# Altium project PCB-MAIN.PrjPcb (part 2 of 3)

## Sheet PCB-MAIN_03_AUDIO.SchDoc
size 594 x 420 mm
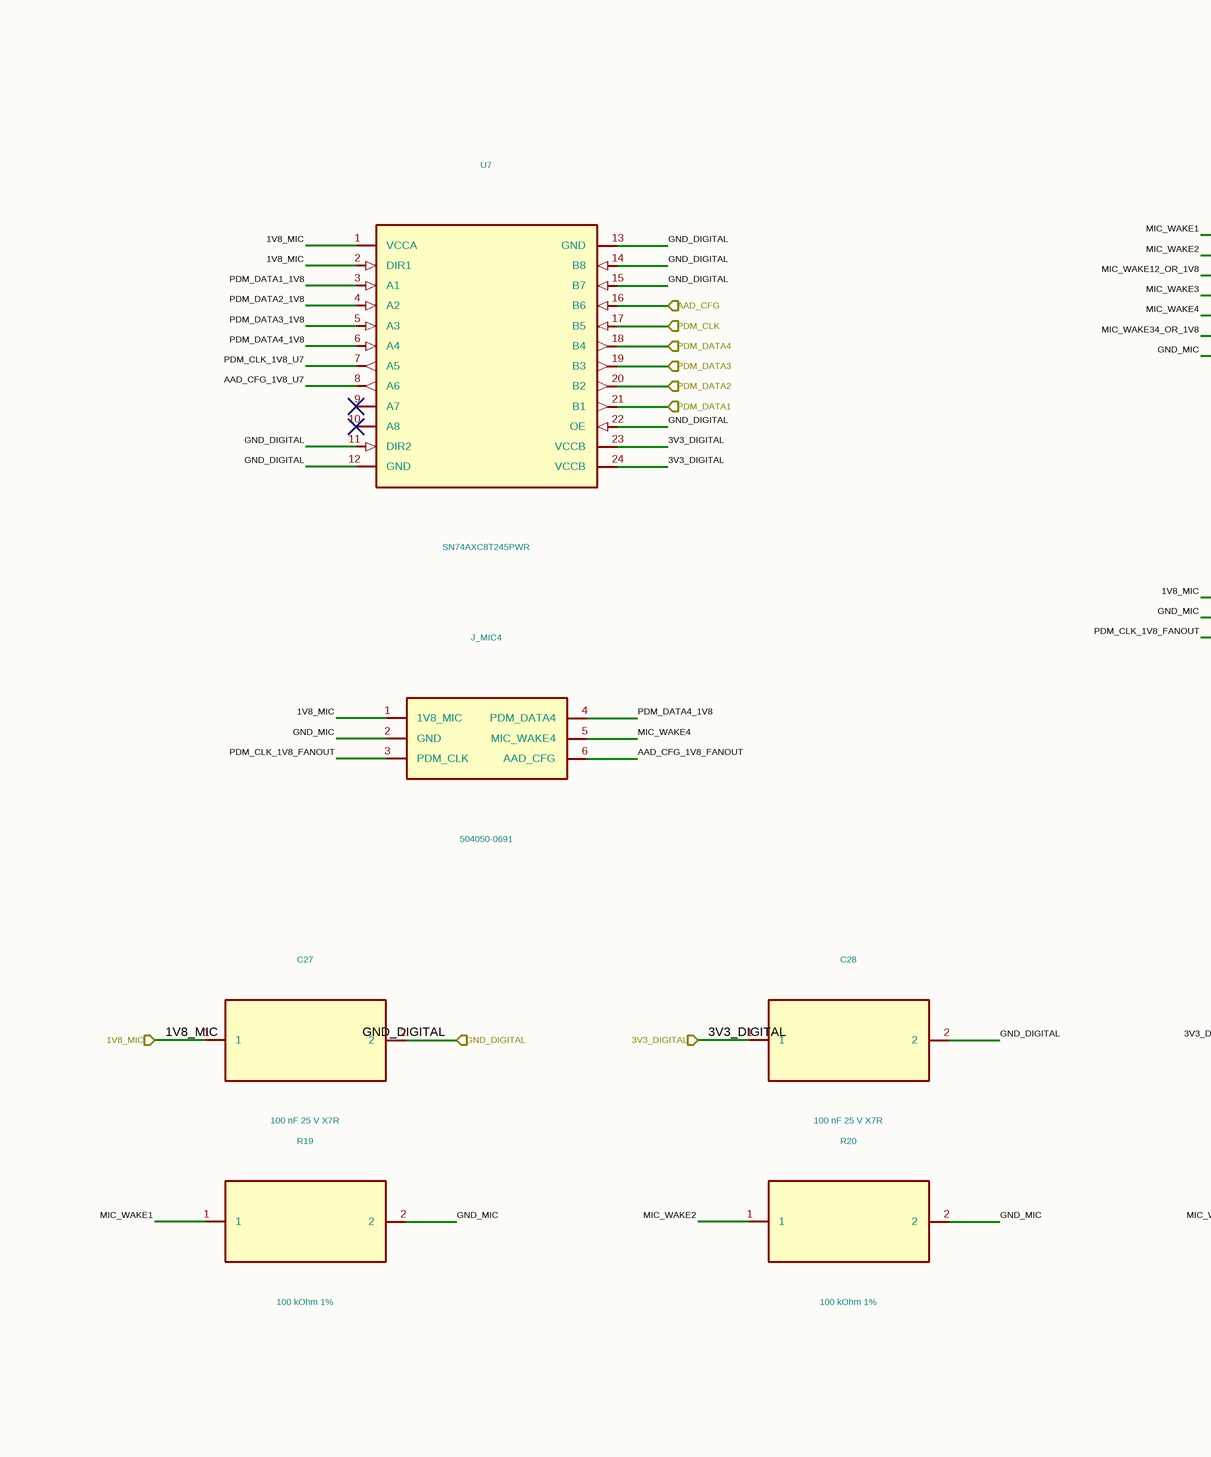
[diagram p21: PCB-MAIN_03_AUDIO.SchDoc, top left]
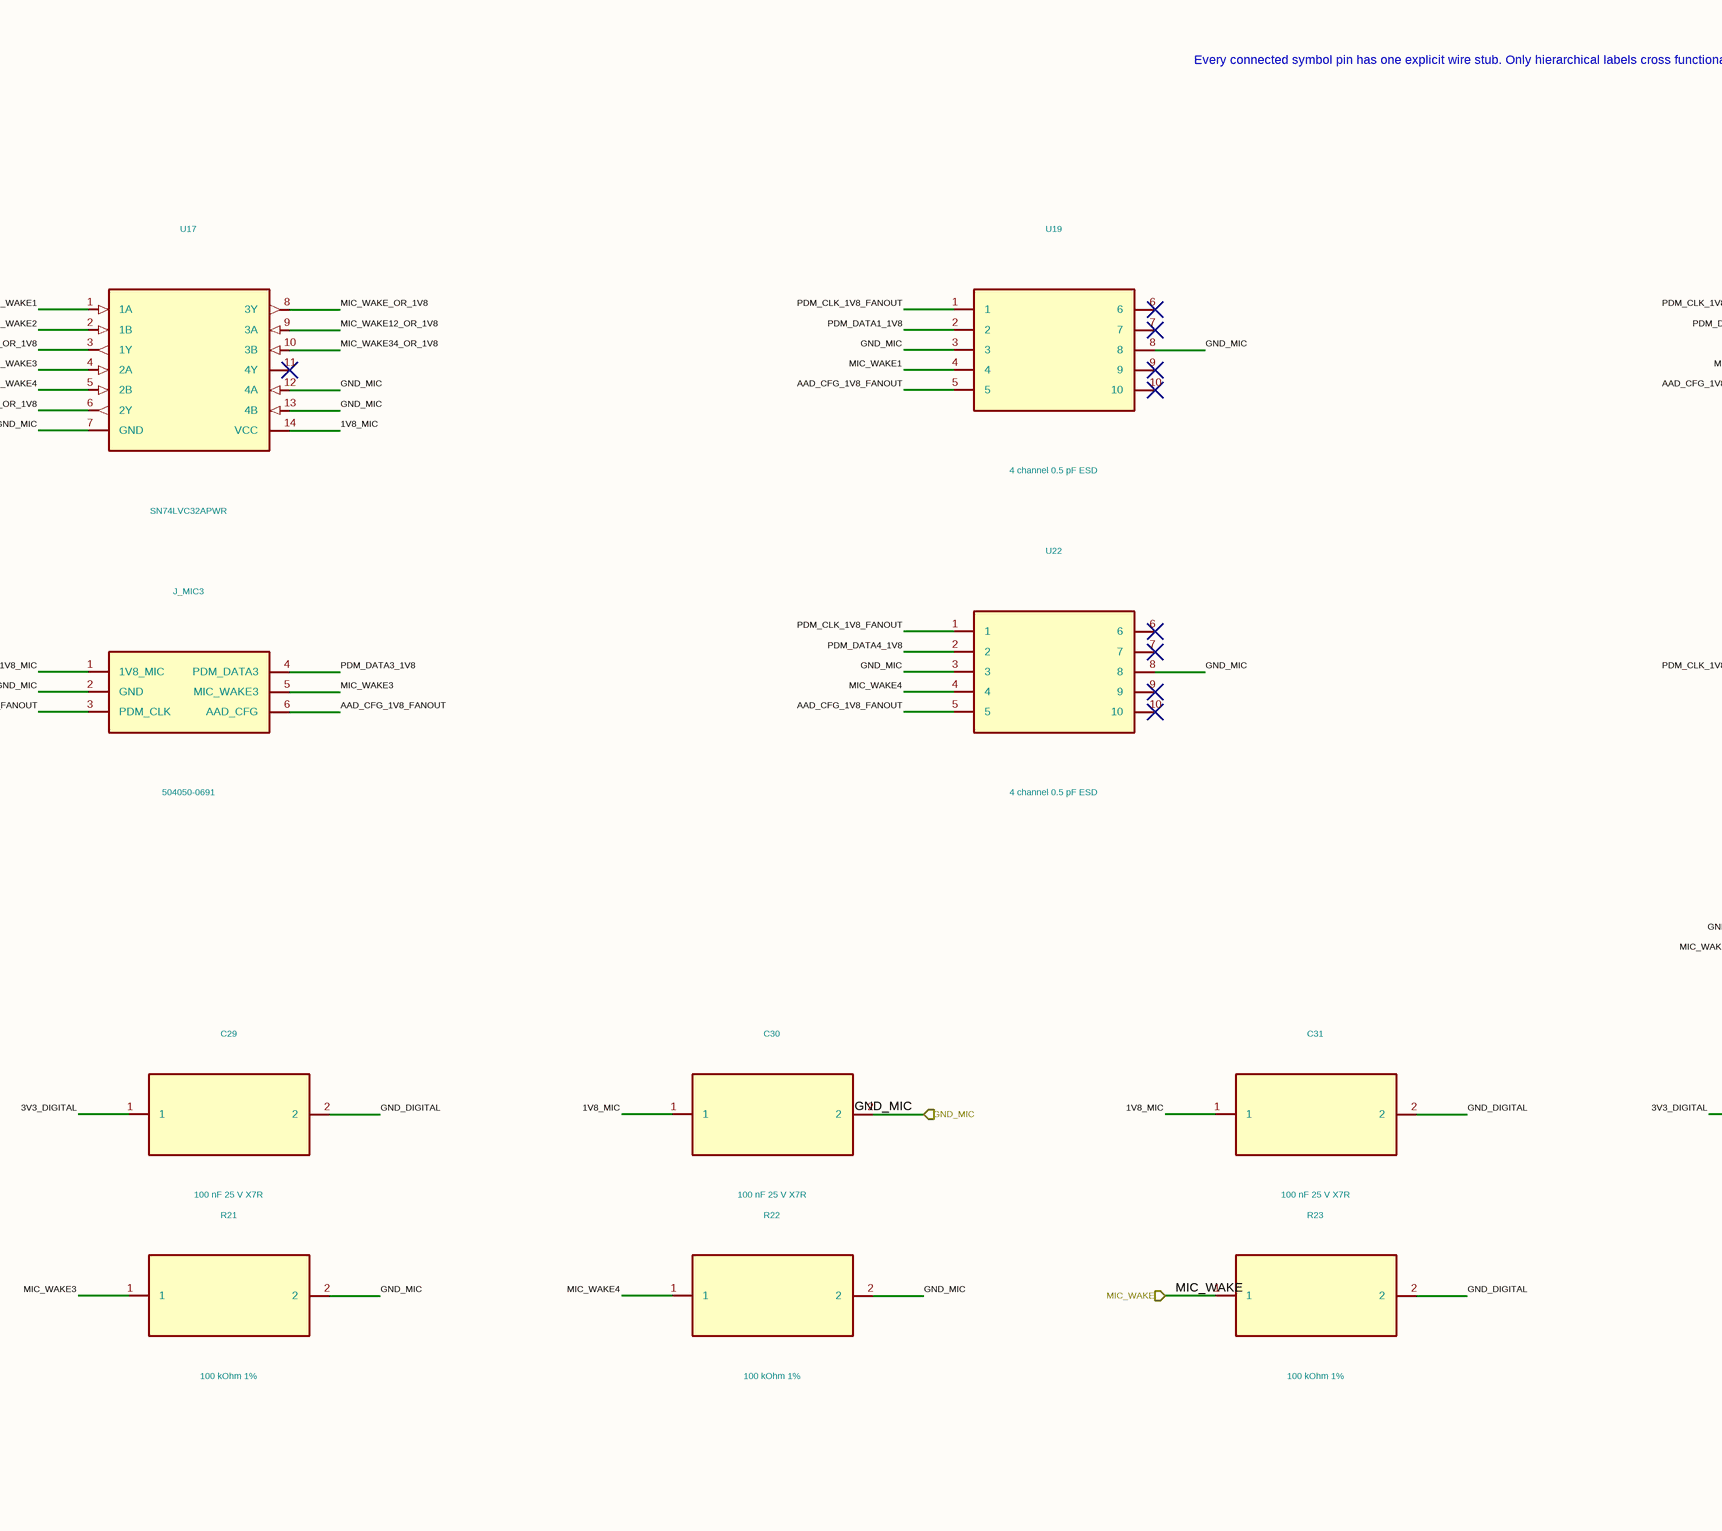
[diagram p22: PCB-MAIN_03_AUDIO.SchDoc, top middle]
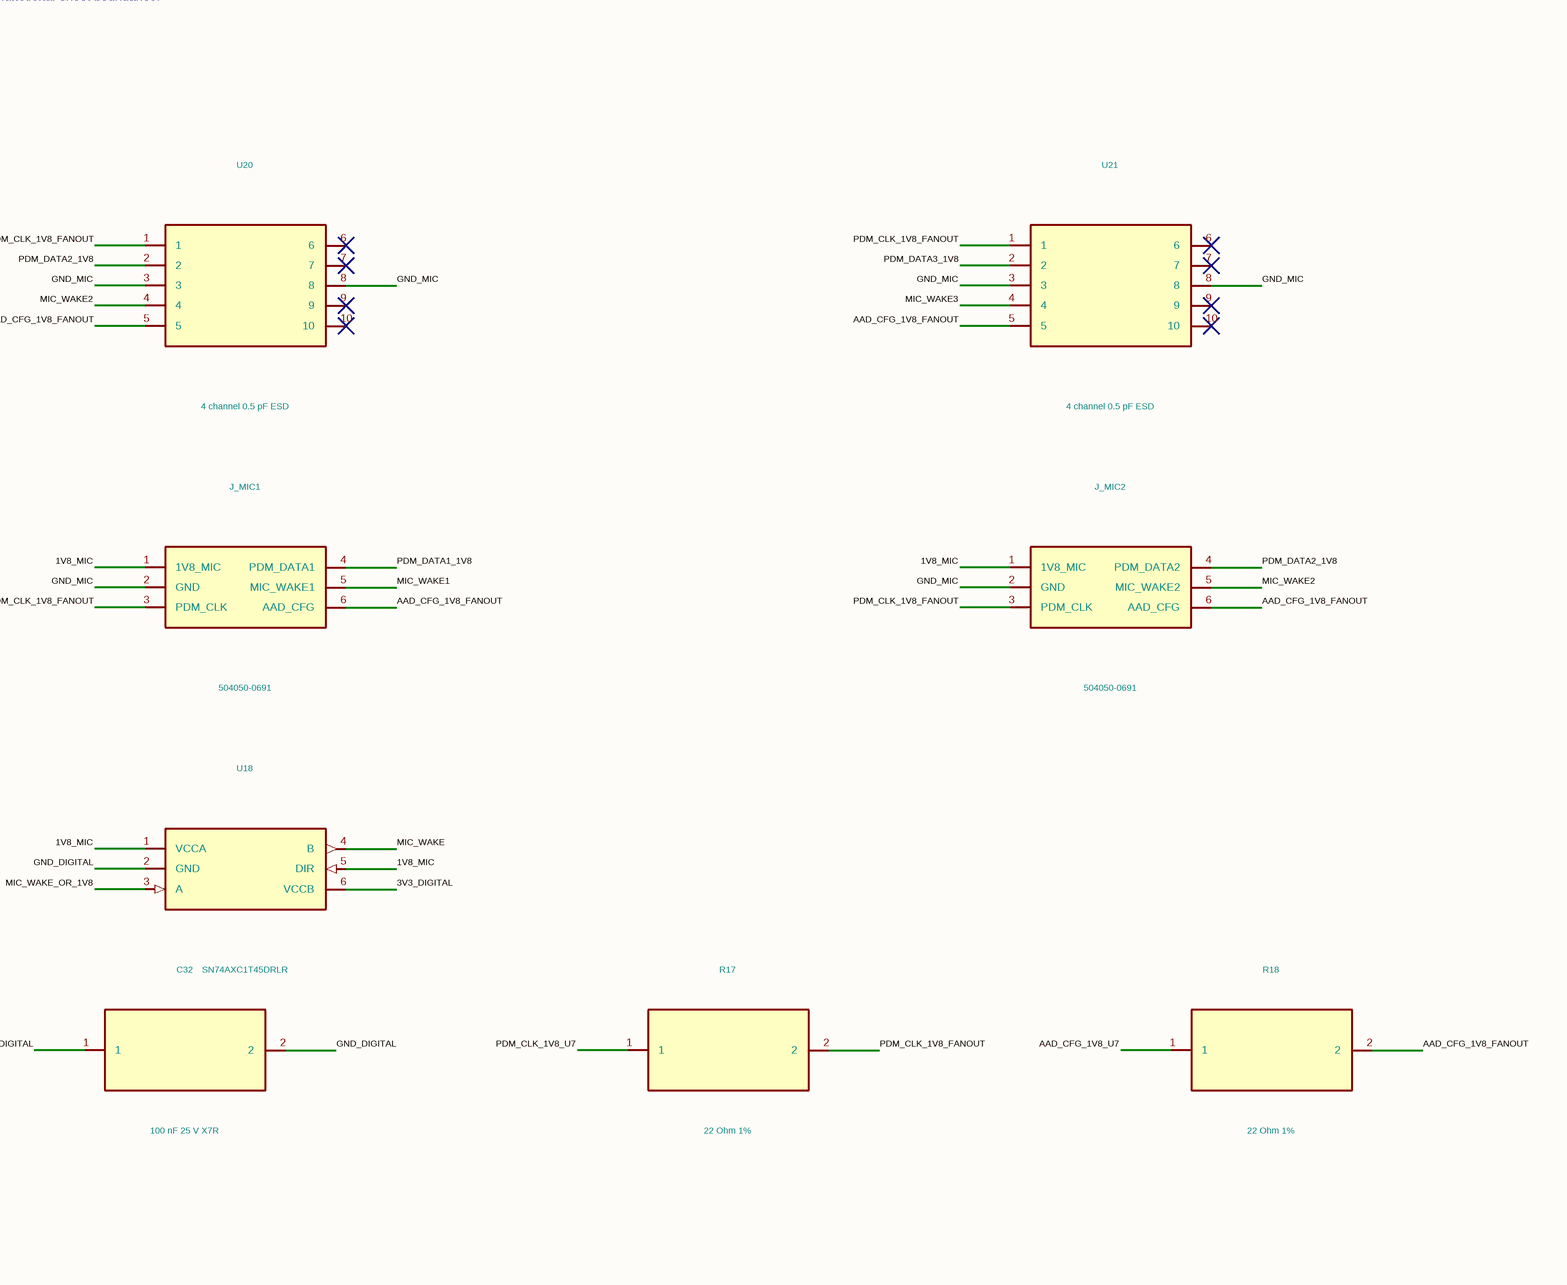
[diagram p23: PCB-MAIN_03_AUDIO.SchDoc, top right]
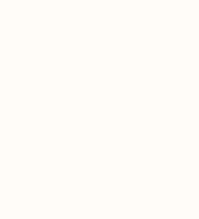
[diagram p24: PCB-MAIN_03_AUDIO.SchDoc, bottom left]

### Parts
C27  100 nF 25 V X7R  [C_0402_1005Metric]
C28  100 nF 25 V X7R  [C_0402_1005Metric]
C29  100 nF 25 V X7R  [C_0402_1005Metric]
C30  100 nF 25 V X7R  [C_0402_1005Metric]
C31  100 nF 25 V X7R  [C_0402_1005Metric]
C32  100 nF 25 V X7R  [C_0402_1005Metric]
J_MIC1  504050-0691
J_MIC2  504050-0691
J_MIC3  504050-0691
J_MIC4  504050-0691
R17  22 Ohm 1%  [R_0402_1005Metric]
R18  22 Ohm 1%  [R_0402_1005Metric]
R19  100 kOhm 1%  [R_0402_1005Metric]
R20  100 kOhm 1%  [R_0402_1005Metric]
R21  100 kOhm 1%  [R_0402_1005Metric]
R22  100 kOhm 1%  [R_0402_1005Metric]
R23  100 kOhm 1%  [R_0402_1005Metric]
U7  SN74AXC8T245PWR
U17  SN74LVC32APWR
U18  SN74AXC1T45DRLR
U19  4 channel 0.5 pF ESD
U20  4 channel 0.5 pF ESD
U21  4 channel 0.5 pF ESD
U22  4 channel 0.5 pF ESD

### Ports
1V8_MIC, 3V3_DIGITAL, AAD_CFG, GND_DIGITAL, GND_MIC, MIC_WAKE, PDM_CLK, PDM_DATA1, PDM_DATA2, PDM_DATA3, PDM_DATA4

### Nets
1V8_MIC: C27.1 C30.1 C31.1 J_MIC1.1(1V8_MIC) J_MIC2.1(1V8_MIC) J_MIC3.1(1V8_MIC) J_MIC4.1(1V8_MIC) U7.1(VCCA) U7.2(DIR1) U17.14(VCC) U18.1(VCCA) U18.5(DIR) ; port 1V8_MIC
3V3_DIGITAL: C28.1 C29.1 C32.1 U7.23(VCCB) U7.24(VCCB) U18.6(VCCB) ; port 3V3_DIGITAL
AAD_CFG: U7.16(B6) ; port AAD_CFG
AAD_CFG_1V8_FANOUT: J_MIC1.6(AAD_CFG) J_MIC2.6(AAD_CFG) J_MIC3.6(AAD_CFG) J_MIC4.6(AAD_CFG) R18.2 U19.5 U20.5 U21.5 U22.5
AAD_CFG_1V8_U7: R18.1 U7.8(A6)
GND_DIGITAL: C27.2 C28.2 C29.2 C31.2 C32.2 R23.2 U7.11(DIR2) U7.12(GND) U7.13(GND) U7.14(B8) U7.15(B7) U7.22(OE) U18.2(GND) ; port GND_DIGITAL
GND_MIC: C30.2 J_MIC1.2(GND) J_MIC2.2(GND) J_MIC3.2(GND) J_MIC4.2(GND) R19.2 R20.2 R21.2 R22.2 U17.7(GND) U17.12(4A) U17.13(4B) U19.3 U19.8 U20.3 U20.8 U21.3 U21.8 U22.3 U22.8 ; port GND_MIC
MIC_WAKE: R23.1 U18.4(B) ; port MIC_WAKE
MIC_WAKE1: J_MIC1.5(MIC_WAKE1) R19.1 U17.1(1A) U19.4
MIC_WAKE2: J_MIC2.5(MIC_WAKE2) R20.1 U17.2(1B) U20.4
MIC_WAKE3: J_MIC3.5(MIC_WAKE3) R21.1 U17.4(2A) U21.4
MIC_WAKE4: J_MIC4.5(MIC_WAKE4) R22.1 U17.5(2B) U22.4
MIC_WAKE12_OR_1V8: U17.3(1Y) U17.9(3A)
MIC_WAKE34_OR_1V8: U17.6(2Y) U17.10(3B)
MIC_WAKE_OR_1V8: U17.8(3Y) U18.3(A)
PDM_CLK: U7.17(B5) ; port PDM_CLK
PDM_CLK_1V8_FANOUT: J_MIC1.3(PDM_CLK) J_MIC2.3(PDM_CLK) J_MIC3.3(PDM_CLK) J_MIC4.3(PDM_CLK) R17.2 U19.1 U20.1 U21.1 U22.1
PDM_CLK_1V8_U7: R17.1 U7.7(A5)
PDM_DATA1: U7.21(B1) ; port PDM_DATA1
PDM_DATA1_1V8: J_MIC1.4(PDM_DATA1) U7.3(A1) U19.2
PDM_DATA2: U7.20(B2) ; port PDM_DATA2
PDM_DATA2_1V8: J_MIC2.4(PDM_DATA2) U7.4(A2) U20.2
PDM_DATA3: U7.19(B3) ; port PDM_DATA3
PDM_DATA3_1V8: J_MIC3.4(PDM_DATA3) U7.5(A3) U21.2
PDM_DATA4: U7.18(B4) ; port PDM_DATA4
PDM_DATA4_1V8: J_MIC4.4(PDM_DATA4) U7.6(A4) U22.2

Not connected (* = marked no-connect by the designer): U7 9(A7)* 10(A8)*; U17 11(4Y)*; U19 6* 7* 9* 10*; U20 6* 7* 9* 10*; U21 6* 7* 9* 10*; U22 6* 7* 9* 10*

### Notes on the sheet
- Every connected symbol pin has one explicit wire stub. Only hierarchical labels cross functional-sheet boundaries.
- 1
- 2
- 3
- 4
- 5
- 6
- 7
- 8
- 9
- 10
- 11
- A
- B
- C
- D
- E
- F
- G
- H
- Human-readable hierarchy candidate; exact Review-A pin/net equivalence enforced
- Functional sheet 4 of 10
- NOT FOR MANUFACTURE - hierarchy review/routing/DRC/DFM/Review B pending
- Title: Dioneya PCB-MAIN Rev.A - PDM audio
- File: PCB-MAIN_03_AUDIO.kicad_sch
- Sheet: /
- Dioneya / ZS-BPLA
- KiCad E.D.A.  kicad (5.1.4)-1
- Size: A2
- Date: 2026-09-16
- Rev: A
- Id: 1/1

### Library data of the parts
C27 = C27_GRM155R71E104KE14D: Manufacturer: Murata; Population: FITTED; Authority: TI_SCES875C_RevC; MPN: GRM155R71E104KE14D; Package: 0402; Value: 100 nF 25 V X7R; Footprint: Capacitor_SMD:C_0402_1005Metric
C28 = C28_GRM155R71E104KE14D: Manufacturer: Murata; Population: FITTED; Authority: TI_SCES875C_RevC; MPN: GRM155R71E104KE14D; Package: 0402; Value: 100 nF 25 V X7R; Footprint: Capacitor_SMD:C_0402_1005Metric
C29 = C29_GRM155R71E104KE14D: Manufacturer: Murata; Population: FITTED; Authority: TI_SCES875C_RevC; MPN: GRM155R71E104KE14D; Package: 0402; Value: 100 nF 25 V X7R; Footprint: Capacitor_SMD:C_0402_1005Metric
C30 = C30_GRM155R71E104KE14D: Manufacturer: Murata; Population: FITTED; Authority: TI_SCAS286U_RevU; MPN: GRM155R71E104KE14D; Package: 0402; Value: 100 nF 25 V X7R; Footprint: Capacitor_SMD:C_0402_1005Metric
C31 = C31_GRM155R71E104KE14D: Manufacturer: Murata; Population: FITTED; Authority: TI_SCES882E_RevE; MPN: GRM155R71E104KE14D; Package: 0402; Value: 100 nF 25 V X7R; Footprint: Capacitor_SMD:C_0402_1005Metric
C32 = C32_GRM155R71E104KE14D: Manufacturer: Murata; Population: FITTED; Authority: TI_SCES882E_RevE; MPN: GRM155R71E104KE14D; Package: 0402; Value: 100 nF 25 V X7R; Footprint: Capacitor_SMD:C_0402_1005Metric
J_MIC1 = J_MIC1_504050-0691: Manufacturer: Molex; Population: FITTED; Authority: HARNESS_LOGICAL_PINOUT_REV_A.csv; MPN: 504050-0691; Package: Pico-Lock_1.5_1x06_Right_Angle; Value: 504050-0691
J_MIC2 = J_MIC2_504050-0691: Manufacturer: Molex; Population: FITTED; Authority: HARNESS_LOGICAL_PINOUT_REV_A.csv; MPN: 504050-0691; Package: Pico-Lock_1.5_1x06_Right_Angle; Value: 504050-0691
J_MIC3 = J_MIC3_504050-0691: Manufacturer: Molex; Population: FITTED; Authority: HARNESS_LOGICAL_PINOUT_REV_A.csv; MPN: 504050-0691; Package: Pico-Lock_1.5_1x06_Right_Angle; Value: 504050-0691
J_MIC4 = J_MIC4_504050-0691: Manufacturer: Molex; Population: FITTED; Authority: HARNESS_LOGICAL_PINOUT_REV_A.csv; MPN: 504050-0691; Package: Pico-Lock_1.5_1x06_Right_Angle; Value: 504050-0691
R17 = R17_ERJ-2RKF22R0X: Manufacturer: Panasonic; Population: FITTED; Authority: PROJECT_MAIN_AUTH_010; MPN: ERJ-2RKF22R0X; Package: 0402; Value: 22 Ohm 1%; Footprint: Resistor_SMD:R_0402_1005Metric
R18 = R18_ERJ-2RKF22R0X: Manufacturer: Panasonic; Population: FITTED; Authority: PROJECT_MAIN_AUTH_010; MPN: ERJ-2RKF22R0X; Package: 0402; Value: 22 Ohm 1%; Footprint: Resistor_SMD:R_0402_1005Metric
R19 = R19_ERJ-2RKF1003X: Manufacturer: Panasonic; Population: FITTED; Authority: TDK_T5838_DS-000383_Rev1.2; MPN: ERJ-2RKF1003X; Package: 0402; Value: 100 kOhm 1%; Footprint: Resistor_SMD:R_0402_1005Metric
R20 = R20_ERJ-2RKF1003X: Manufacturer: Panasonic; Population: FITTED; Authority: TDK_T5838_DS-000383_Rev1.2; MPN: ERJ-2RKF1003X; Package: 0402; Value: 100 kOhm 1%; Footprint: Resistor_SMD:R_0402_1005Metric
R21 = R21_ERJ-2RKF1003X: Manufacturer: Panasonic; Population: FITTED; Authority: TDK_T5838_DS-000383_Rev1.2; MPN: ERJ-2RKF1003X; Package: 0402; Value: 100 kOhm 1%; Footprint: Resistor_SMD:R_0402_1005Metric
R22 = R22_ERJ-2RKF1003X: Manufacturer: Panasonic; Population: FITTED; Authority: TDK_T5838_DS-000383_Rev1.2; MPN: ERJ-2RKF1003X; Package: 0402; Value: 100 kOhm 1%; Footprint: Resistor_SMD:R_0402_1005Metric
R23 = R23_ERJ-2RKF1003X: Manufacturer: Panasonic; Population: FITTED; Authority: TI_SCES882E_RevE; MPN: ERJ-2RKF1003X; Package: 0402; Value: 100 kOhm 1%; Footprint: Resistor_SMD:R_0402_1005Metric
U7 = U7_SN74AXC8T245PWR: Manufacturer: Texas Instruments; Population: FITTED; Authority: PCB_MAIN_AUDIO_LOGIC_PIN_AUTHORITY_REV_A.csv; MPN: SN74AXC8T245PWR; Package: TSSOP-24_PW; Value: SN74AXC8T245PWR
U17 = U17_SN74LVC32APWR: Manufacturer: Texas Instruments; Population: FITTED; Authority: PCB_MAIN_AUDIO_LOGIC_PIN_AUTHORITY_REV_A.csv; MPN: SN74LVC32APWR; Package: TSSOP-14_PW; Value: SN74LVC32APWR
U18 = U18_SN74AXC1T45DRLR: Manufacturer: Texas Instruments; Population: FITTED; Authority: PCB_MAIN_AUDIO_LOGIC_PIN_AUTHORITY_REV_A.csv; MPN: SN74AXC1T45DRLR; Package: SOT-5X3-6_DRL; Value: SN74AXC1T45DRLR
U19 = U19_TPD4E05U06DQAR: Manufacturer: Texas Instruments; Population: FITTED; Authority: TI_TPDxE05U06_RevO; MPN: TPD4E05U06DQAR; Package: USON-10_DQA; Value: 4 channel 0.5 pF ESD
U20 = U20_TPD4E05U06DQAR: Manufacturer: Texas Instruments; Population: FITTED; Authority: TI_TPDxE05U06_RevO; MPN: TPD4E05U06DQAR; Package: USON-10_DQA; Value: 4 channel 0.5 pF ESD
U21 = U21_TPD4E05U06DQAR: Manufacturer: Texas Instruments; Population: FITTED; Authority: TI_TPDxE05U06_RevO; MPN: TPD4E05U06DQAR; Package: USON-10_DQA; Value: 4 channel 0.5 pF ESD
U22 = U22_TPD4E05U06DQAR: Manufacturer: Texas Instruments; Population: FITTED; Authority: TI_TPDxE05U06_RevO; MPN: TPD4E05U06DQAR; Package: USON-10_DQA; Value: 4 channel 0.5 pF ESD

## Sheet PCB-MAIN_04_GNSS.SchDoc
size 594 x 420 mm
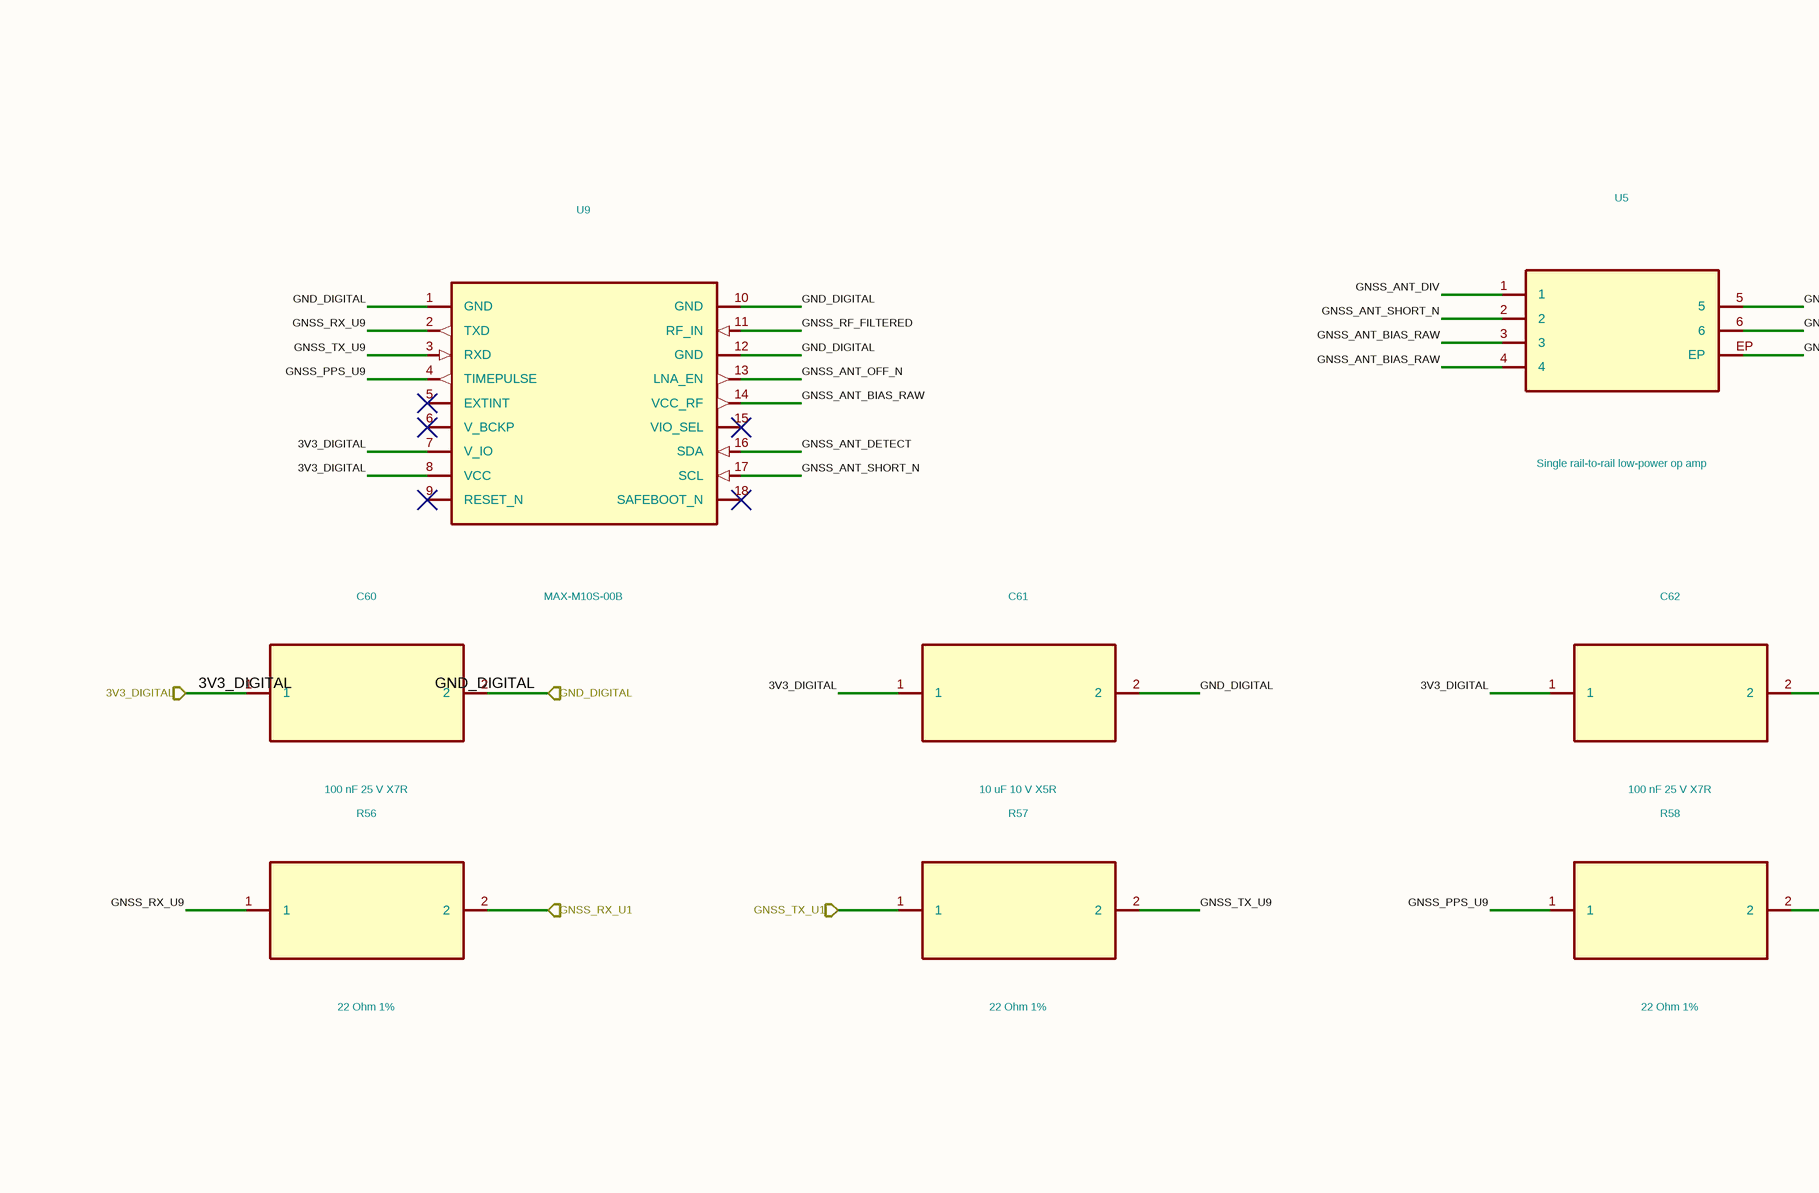
[diagram p25: PCB-MAIN_04_GNSS.SchDoc, top left]
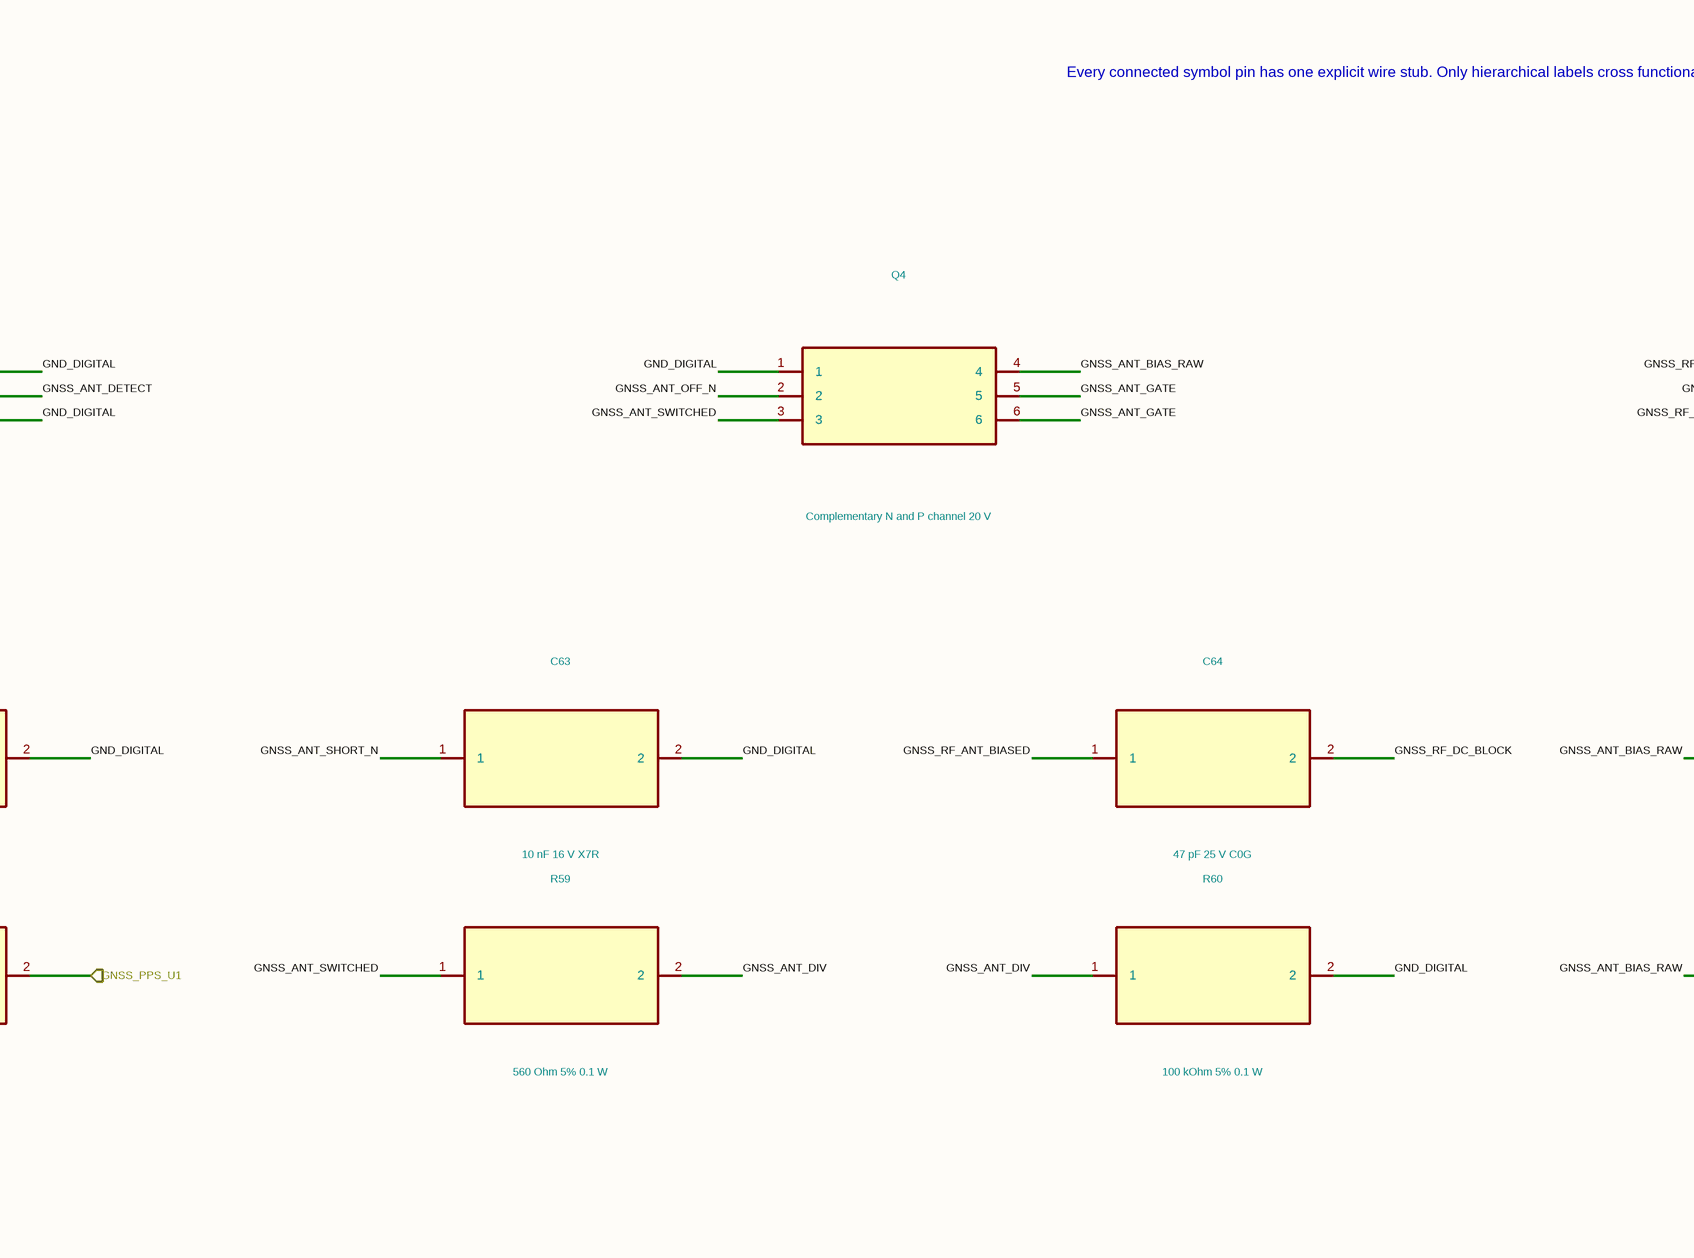
[diagram p26: PCB-MAIN_04_GNSS.SchDoc, top middle]
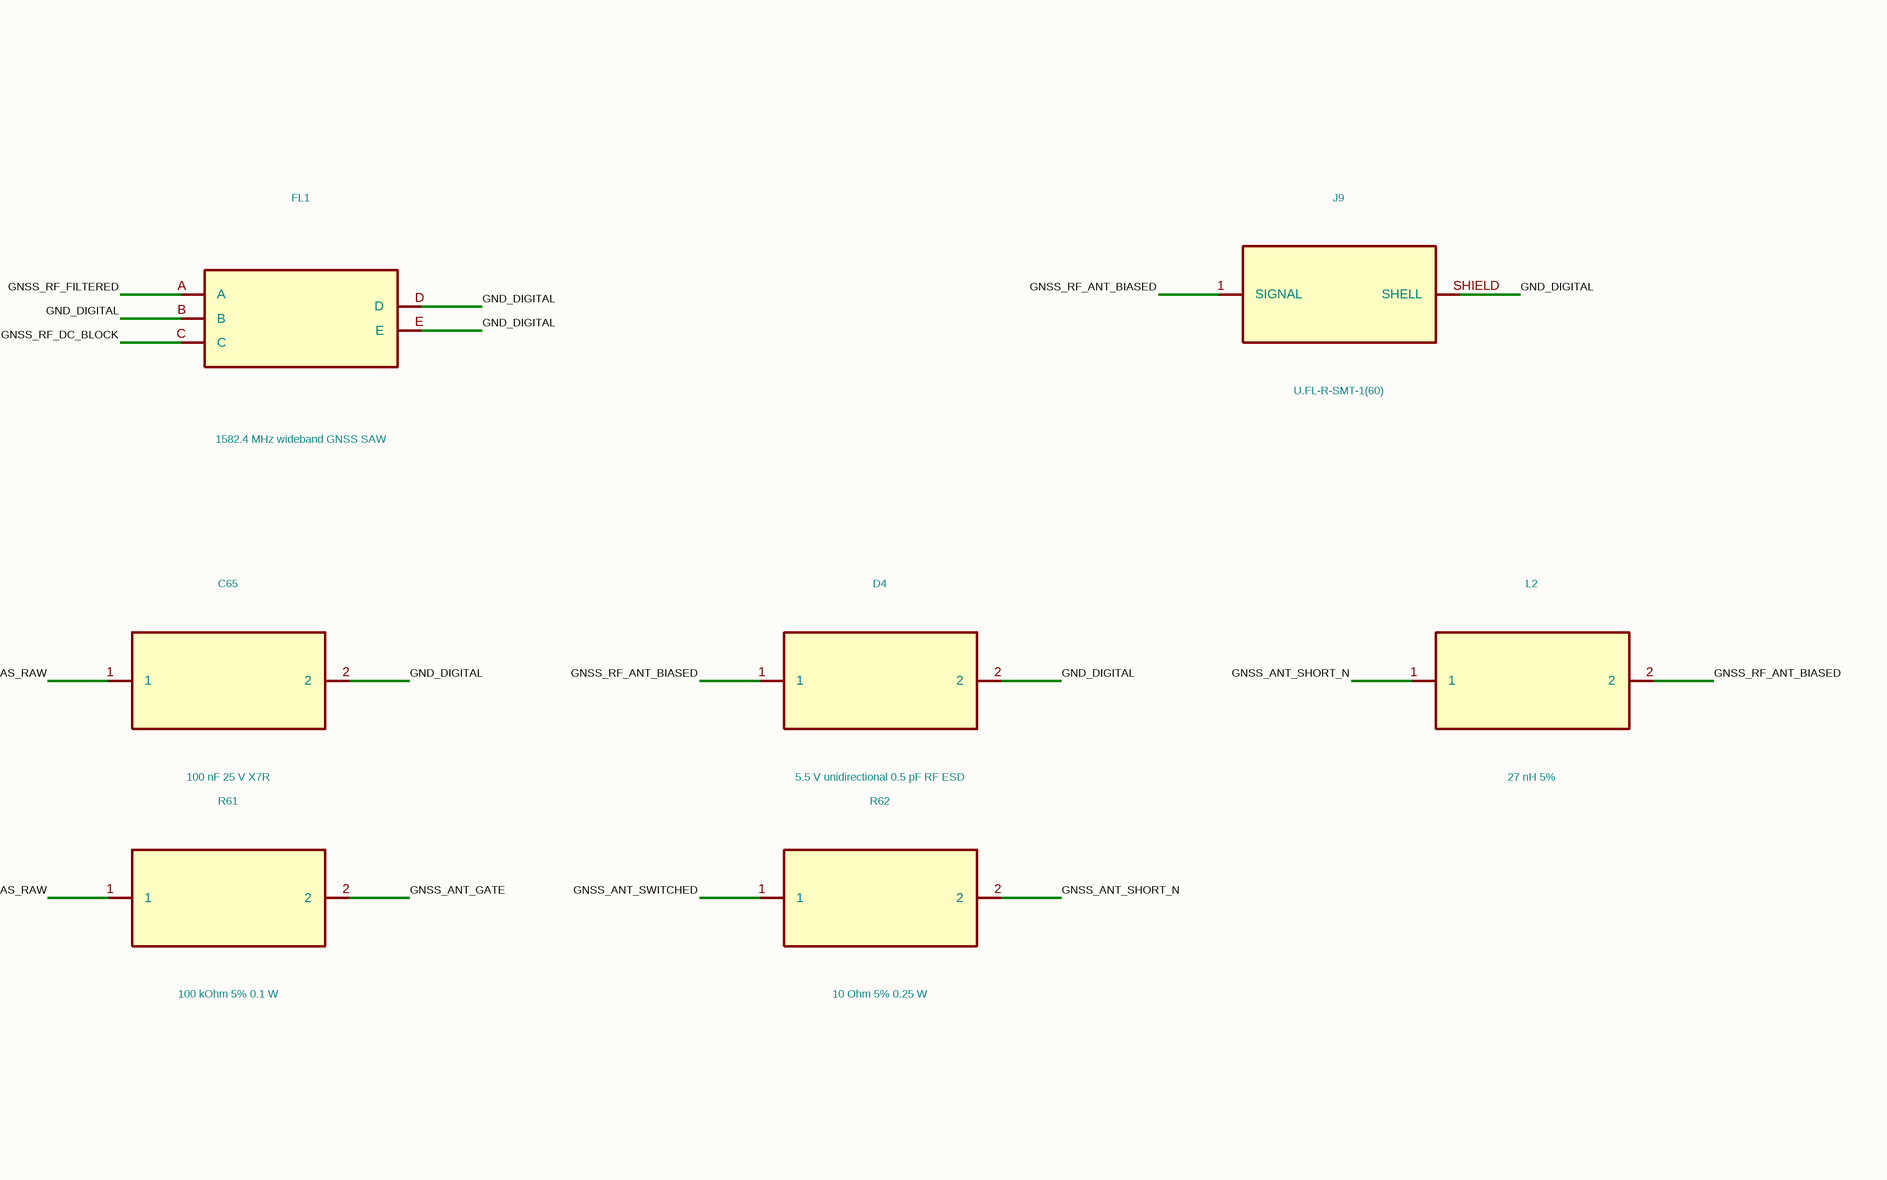
[diagram p27: PCB-MAIN_04_GNSS.SchDoc, top right]
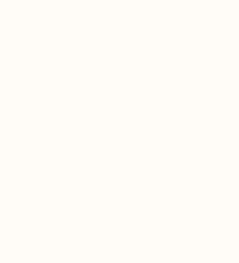
[diagram p28: PCB-MAIN_04_GNSS.SchDoc, bottom left]

### Parts
C60  100 nF 25 V X7R  [C_0402_1005Metric]
C61  10 uF 10 V X5R  [C_0603_1608Metric]
C62  100 nF 25 V X7R  [C_0402_1005Metric]
C63  10 nF 16 V X7R  [C_0402_1005Metric]
C64  47 pF 25 V C0G  [C_0402_1005Metric]
C65  100 nF 25 V X7R  [C_0402_1005Metric]
D4  5.5 V unidirectional 0.5 pF RF ESD
FL1  1582.4 MHz wideband GNSS SAW
J9  U.FL-R-SMT-1(60)
L2  27 nH 5%  [L_0402_1005Metric]
Q4  Complementary N and P channel 20 V
R56  22 Ohm 1%  [R_0402_1005Metric]
R57  22 Ohm 1%  [R_0402_1005Metric]
R58  22 Ohm 1%  [R_0402_1005Metric]
R59  560 Ohm 5% 0.1 W  [R_0402_1005Metric]
R60  100 kOhm 5% 0.1 W  [R_0402_1005Metric]
R61  100 kOhm 5% 0.1 W  [R_0402_1005Metric]
R62  10 Ohm 5% 0.25 W  [R_1206_3216Metric]
U5  Single rail-to-rail low-power op amp
U9  MAX-M10S-00B

### Ports
3V3_DIGITAL, GND_DIGITAL, GNSS_PPS_U1, GNSS_RX_U1, GNSS_TX_U1

### Nets
3V3_DIGITAL: C60.1 C61.1 C62.1 U9.7(V_IO) U9.8(VCC) ; port 3V3_DIGITAL
GND_DIGITAL: C60.2 C61.2 C62.2 C63.2 C65.2 D4.2 FL1.B FL1.D FL1.E J9.SHIELD(SHELL) Q4.1 R60.2 U5.5 U5.EP U9.1(GND) U9.10(GND) U9.12(GND) ; port GND_DIGITAL
GNSS_ANT_BIAS_RAW: C65.1 Q4.4 R61.1 U5.3 U5.4 U9.14(VCC_RF)
GNSS_ANT_DETECT: U5.6 U9.16(SDA)
GNSS_ANT_DIV: R59.2 R60.1 U5.1
GNSS_ANT_GATE: Q4.5 Q4.6 R61.2
GNSS_ANT_OFF_N: Q4.2 U9.13(LNA_EN)
GNSS_ANT_SHORT_N: C63.1 L2.1 R62.2 U5.2 U9.17(SCL)
GNSS_ANT_SWITCHED: Q4.3 R59.1 R62.1
GNSS_PPS_U1: R58.2 ; port GNSS_PPS_U1
GNSS_PPS_U9: R58.1 U9.4(TIMEPULSE)
GNSS_RF_ANT_BIASED: C64.1 D4.1 J9.1(SIGNAL) L2.2
GNSS_RF_DC_BLOCK: C64.2 FL1.C
GNSS_RF_FILTERED: FL1.A U9.11(RF_IN)
GNSS_RX_U1: R56.2 ; port GNSS_RX_U1
GNSS_RX_U9: R56.1 U9.2(TXD)
GNSS_TX_U1: R57.1 ; port GNSS_TX_U1
GNSS_TX_U9: R57.2 U9.3(RXD)

Not connected (* = marked no-connect by the designer): U9 5(EXTINT)* 6(V_BCKP)* 9(RESET_N)* 15(VIO_SEL)* 18(SAFEBOOT_N)*

### Notes on the sheet
- Every connected symbol pin has one explicit wire stub. Only hierarchical labels cross functional-sheet boundaries.
- 1
- 2
- 3
- 4
- 5
- 6
- 7
- 8
- 9
- 10
- 11
- A
- B
- C
- D
- E
- F
- G
- H
- Human-readable hierarchy candidate; exact Review-A pin/net equivalence enforced
- Functional sheet 5 of 10
- NOT FOR MANUFACTURE - hierarchy review/routing/DRC/DFM/Review B pending
- Title: Dioneya PCB-MAIN Rev.A - GNSS
- File: PCB-MAIN_04_GNSS.kicad_sch
- Sheet: /
- Dioneya / ZS-BPLA
- KiCad E.D.A.  kicad (5.1.4)-1
- Size: A2
- Date: 2026-09-16
- Rev: A
- Id: 1/1

### Library data of the parts
C60 = C60_GRM155R71E104KE14D: Manufacturer: Murata; Population: FITTED; Authority: u-blox_UBX-20053088_R05; MPN: GRM155R71E104KE14D; Package: 0402; Value: 100 nF 25 V X7R; Footprint: Capacitor_SMD:C_0402_1005Metric
C61 = C61_GRM188R61A106KE69D: Manufacturer: Murata; Population: FITTED; Authority: u-blox_UBX-20053088_R05; MPN: GRM188R61A106KE69D; Package: 0603; Value: 10 uF 10 V X5R; Footprint: Capacitor_SMD:C_0603_1608Metric
C62 = C62_GRM155R71E104KE14D: Manufacturer: Murata; Population: FITTED; Authority: u-blox_UBX-20053088_R05; MPN: GRM155R71E104KE14D; Package: 0402; Value: 100 nF 25 V X7R; Footprint: Capacitor_SMD:C_0402_1005Metric
C63 = C63_GRM155R71C103KA01D: Manufacturer: Murata; Population: FITTED; Authority: u-blox_UBX-20053088_R05; MPN: GRM155R71C103KA01D; Package: 0402; Value: 10 nF 16 V X7R; Footprint: Capacitor_SMD:C_0402_1005Metric
C64 = C64_GRM1555C1E470JA01D: Manufacturer: Murata; Population: FITTED; Authority: u-blox_UBX-20053088_R05; MPN: GRM1555C1E470JA01D; Package: 0402; Value: 47 pF 25 V C0G; Footprint: Capacitor_SMD:C_0402_1005Metric
C65 = C65_GRM155R71E104KE14D: Manufacturer: Murata; Population: FITTED; Authority: ADI_LT6000_datasheet; MPN: GRM155R71E104KE14D; Package: 0402; Value: 100 nF 25 V X7R; Footprint: Capacitor_SMD:C_0402_1005Metric
D4 = D4_TPD1E05U06DYAR: Manufacturer: Texas Instruments; Population: FITTED; Authority: TI_TPDxE05U06_RevO; MPN: TPD1E05U06DYAR; Package: SOD-523_DYA; Value: 5.5 V unidirectional 0.5 pF RF ESD
FL1 = FL1_ABSES5AF-L100KM: Manufacturer: Abracon; Population: FITTED; Authority: Abracon_ABSES5AF-L100KM_2025-09-16; MPN: ABSES5AF-L100KM; Package: 1109-5; Value: 1582.4 MHz wideband GNSS SAW
J9 = J9_U.FL-R-SMT-1_60: Manufacturer: CONTROLLED_AUTHORITY; Population: FITTED; Authority: PCB_MAIN_GNSS_PIN_AUTHORITY_REV_A.csv;PCB_MAIN_CONNECTOR_FIXTURE_PIN_AUTHORITY_REV_A.csv; MPN: U.FL-R-SMT-1(60); Package: U.FL_SMT; Value: U.FL-R-SMT-1(60)
L2 = L2_LQW15AN27NJ00D: Manufacturer: Murata; Population: FITTED; Authority: u-blox_UBX-20053088_R05; MPN: LQW15AN27NJ00D; Package: 0402; Value: 27 nH 5%; Footprint: Inductor_SMD:L_0402_1005Metric
Q4 = Q4_Si1016X-T1-GE3: Manufacturer: Vishay; Population: FITTED; Authority: Vishay_Si1016X_RevE; MPN: Si1016X-T1-GE3; Package: SOT-563_SC-89; Value: Complementary N and P channel 20 V
R56 = R56_ERJ-2RKF22R0X: Manufacturer: Panasonic; Population: FITTED; Authority: u-blox_UBX-20053088_R05; MPN: ERJ-2RKF22R0X; Package: 0402; Value: 22 Ohm 1%; Footprint: Resistor_SMD:R_0402_1005Metric
R57 = R57_ERJ-2RKF22R0X: Manufacturer: Panasonic; Population: FITTED; Authority: u-blox_UBX-20053088_R05; MPN: ERJ-2RKF22R0X; Package: 0402; Value: 22 Ohm 1%; Footprint: Resistor_SMD:R_0402_1005Metric
R58 = R58_ERJ-2RKF22R0X: Manufacturer: Panasonic; Population: FITTED; Authority: u-blox_UBX-20053088_R05; MPN: ERJ-2RKF22R0X; Package: 0402; Value: 22 Ohm 1%; Footprint: Resistor_SMD:R_0402_1005Metric
R59 = R59_ERJ-2GEJ561X: Manufacturer: Panasonic; Population: FITTED; Authority: u-blox_UBX-20053088_R05; MPN: ERJ-2GEJ561X; Package: 0402; Value: 560 Ohm 5% 0.1 W; Footprint: Resistor_SMD:R_0402_1005Metric
R60 = R60_ERJ-2GEJ104X: Manufacturer: Panasonic; Population: FITTED; Authority: u-blox_UBX-20053088_R05; MPN: ERJ-2GEJ104X; Package: 0402; Value: 100 kOhm 5% 0.1 W; Footprint: Resistor_SMD:R_0402_1005Metric
R61 = R61_ERJ-2GEJ104X: Manufacturer: Panasonic; Population: FITTED; Authority: u-blox_UBX-20053088_R05; MPN: ERJ-2GEJ104X; Package: 0402; Value: 100 kOhm 5% 0.1 W; Footprint: Resistor_SMD:R_0402_1005Metric
R62 = R62_ERJ-8GEYJ100V: Manufacturer: Panasonic; Population: FITTED; Authority: u-blox_UBX-20053088_R05; MPN: ERJ-8GEYJ100V; Package: 1206; Value: 10 Ohm 5% 0.25 W; Footprint: Resistor_SMD:R_1206_3216Metric
U5 = U5_LT6000IDCB_TRMPBF: Manufacturer: Analog Devices; MPN: LT6000IDCB#TRMPBF; Population: FITTED; Authority: ADI_LT6000_datasheet; Package: DFN-6_DCB_2x3mm; Value: Single rail-to-rail low-power op amp
U9 = U9_MAX-M10S-00B: Manufacturer: u-blox; Population: FITTED; Authority: PCB_MAIN_GNSS_PIN_AUTHORITY_REV_A.csv; MPN: MAX-M10S-00B; Package: LCC-18_9.7x10.1mm; Value: MAX-M10S-00B

## Sheet PCB-MAIN_05_CELLULAR.SchDoc
size 594 x 420 mm
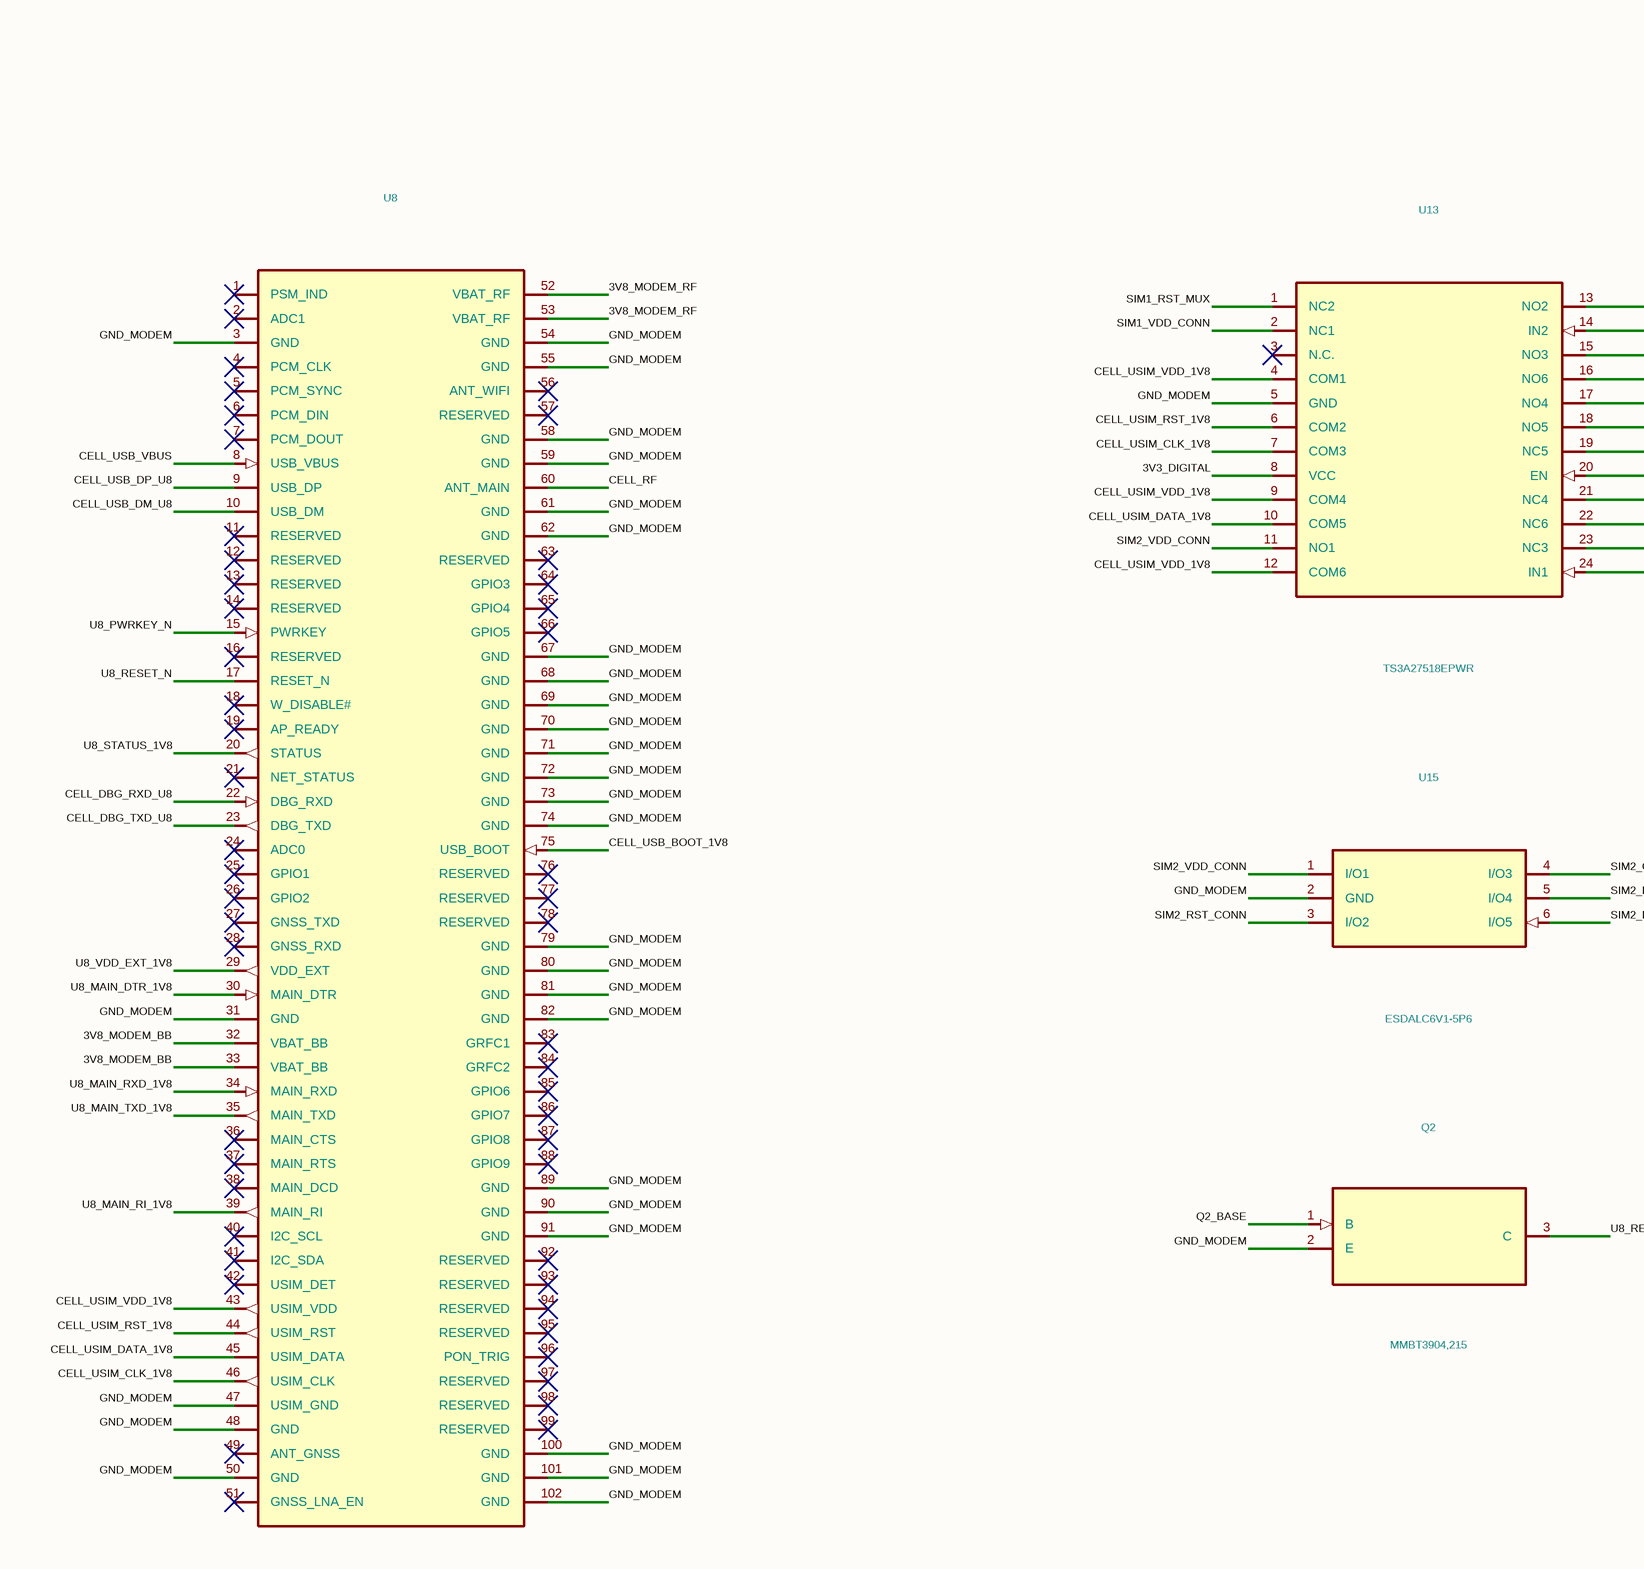
[diagram p29: PCB-MAIN_05_CELLULAR.SchDoc, top left]
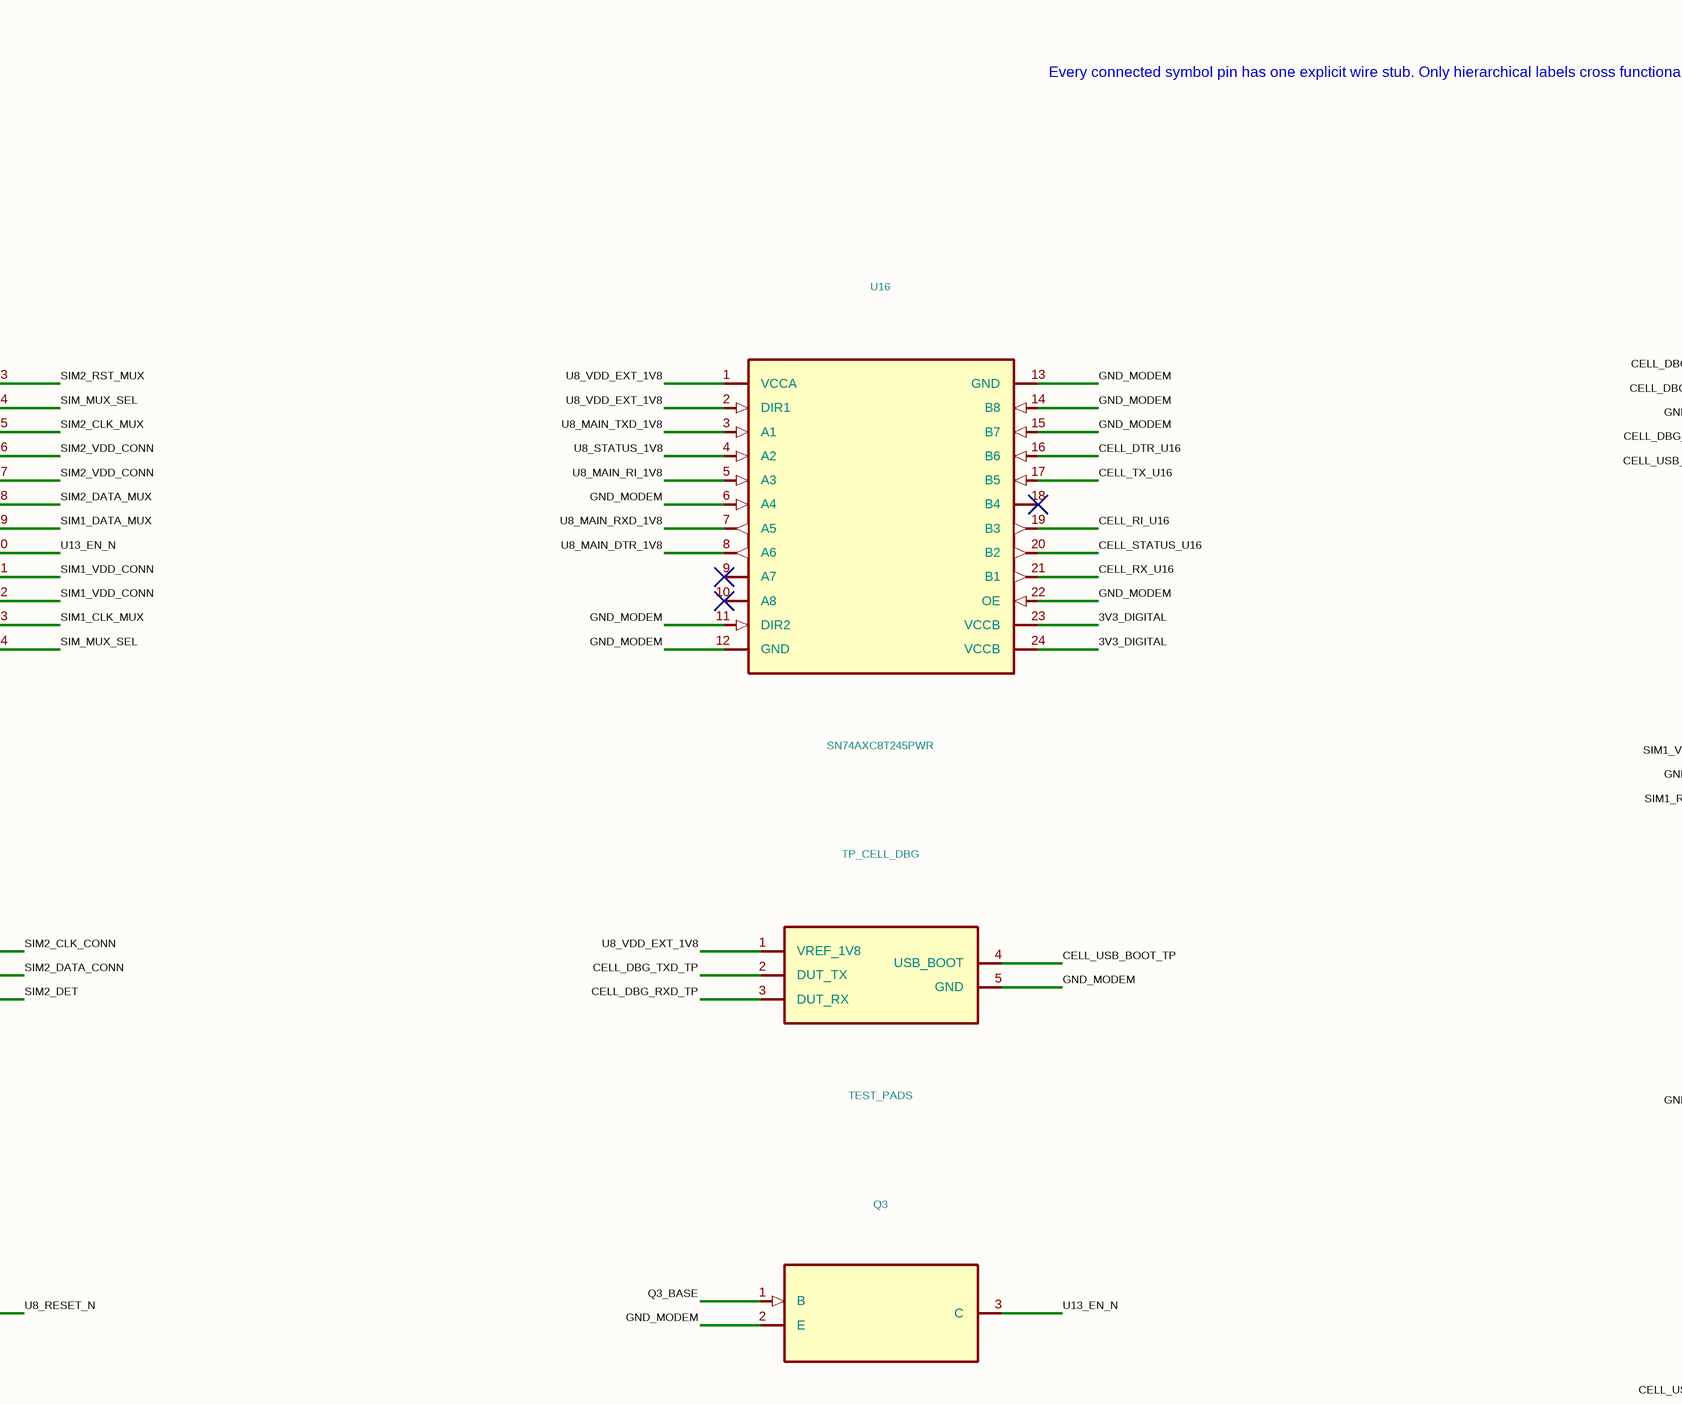
[diagram p30: PCB-MAIN_05_CELLULAR.SchDoc, top middle]
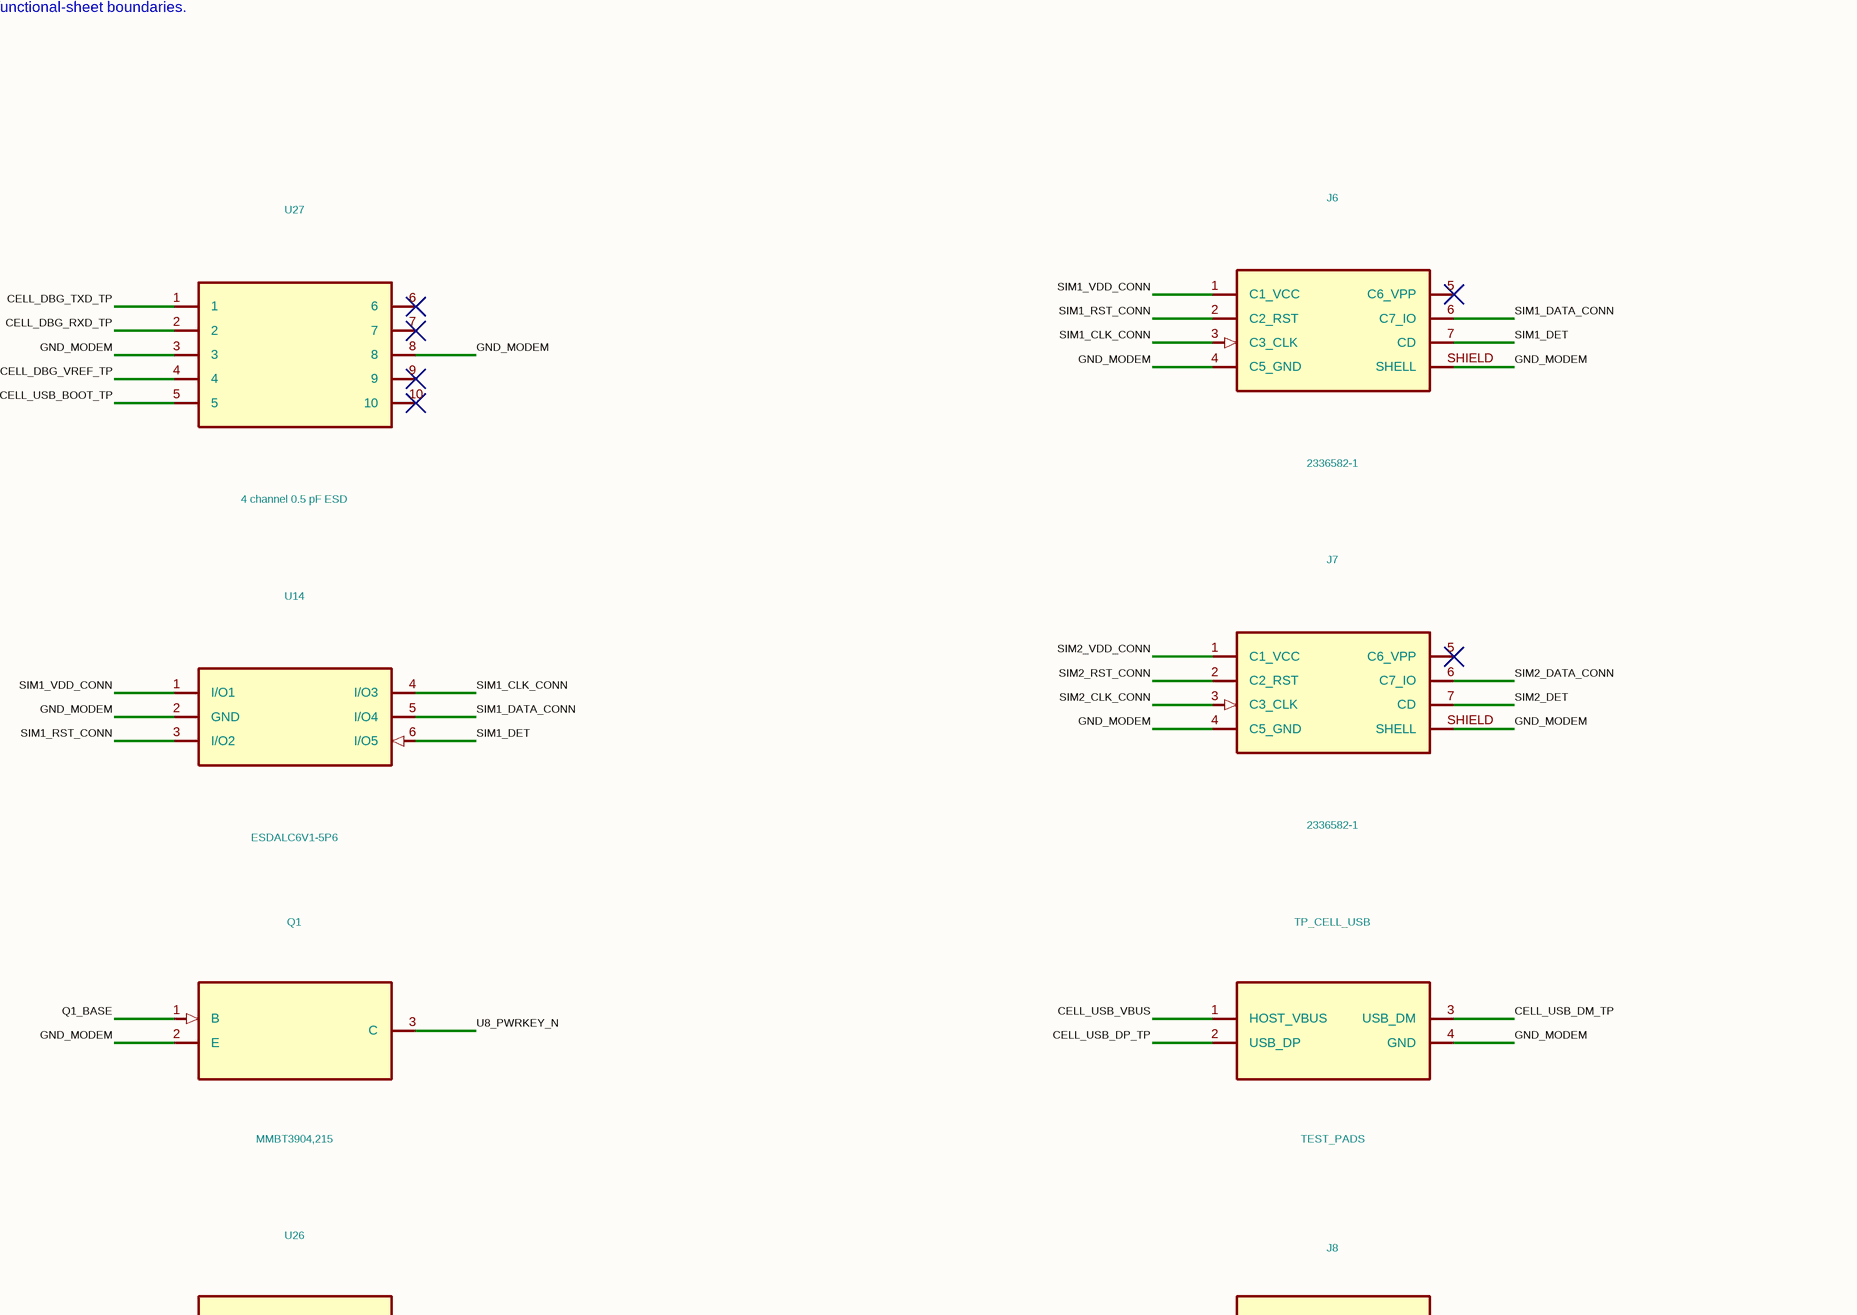
[diagram p31: PCB-MAIN_05_CELLULAR.SchDoc, top right]
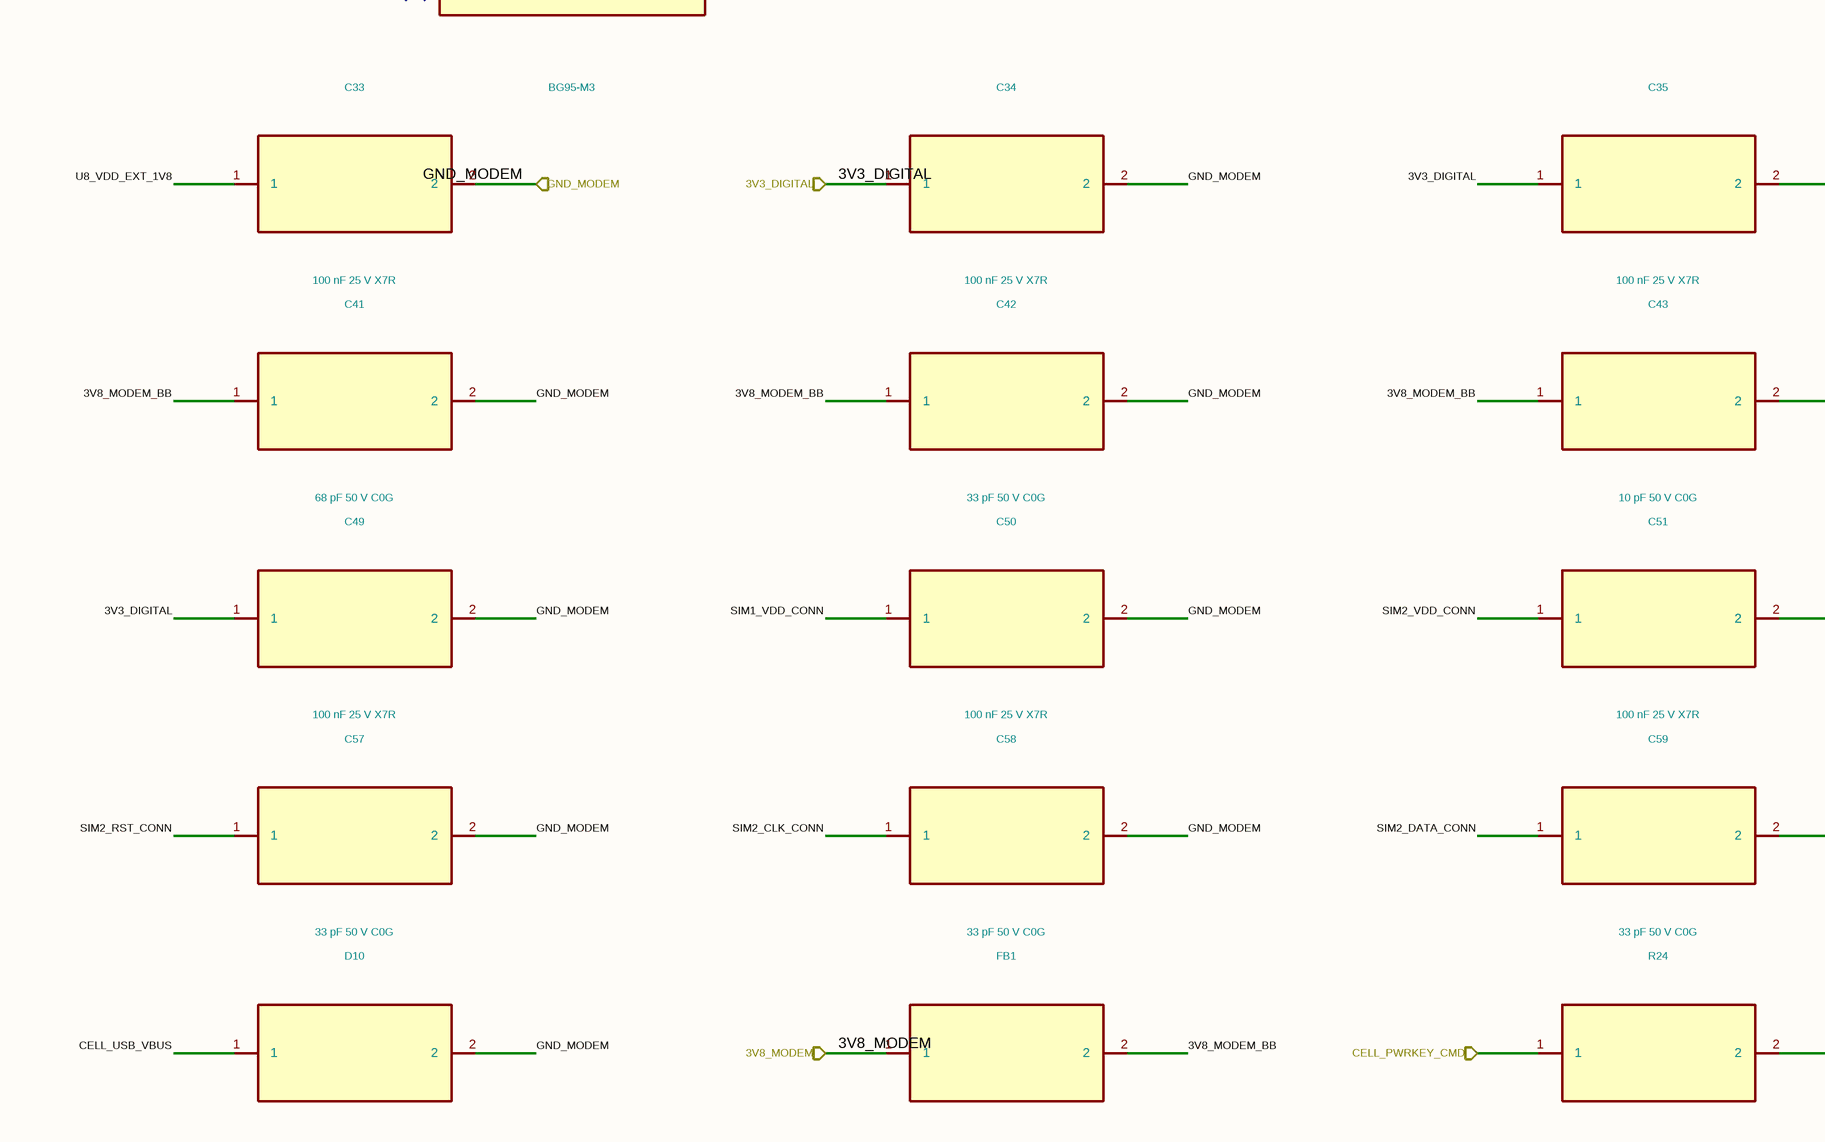
[diagram p32: PCB-MAIN_05_CELLULAR.SchDoc, centre left]
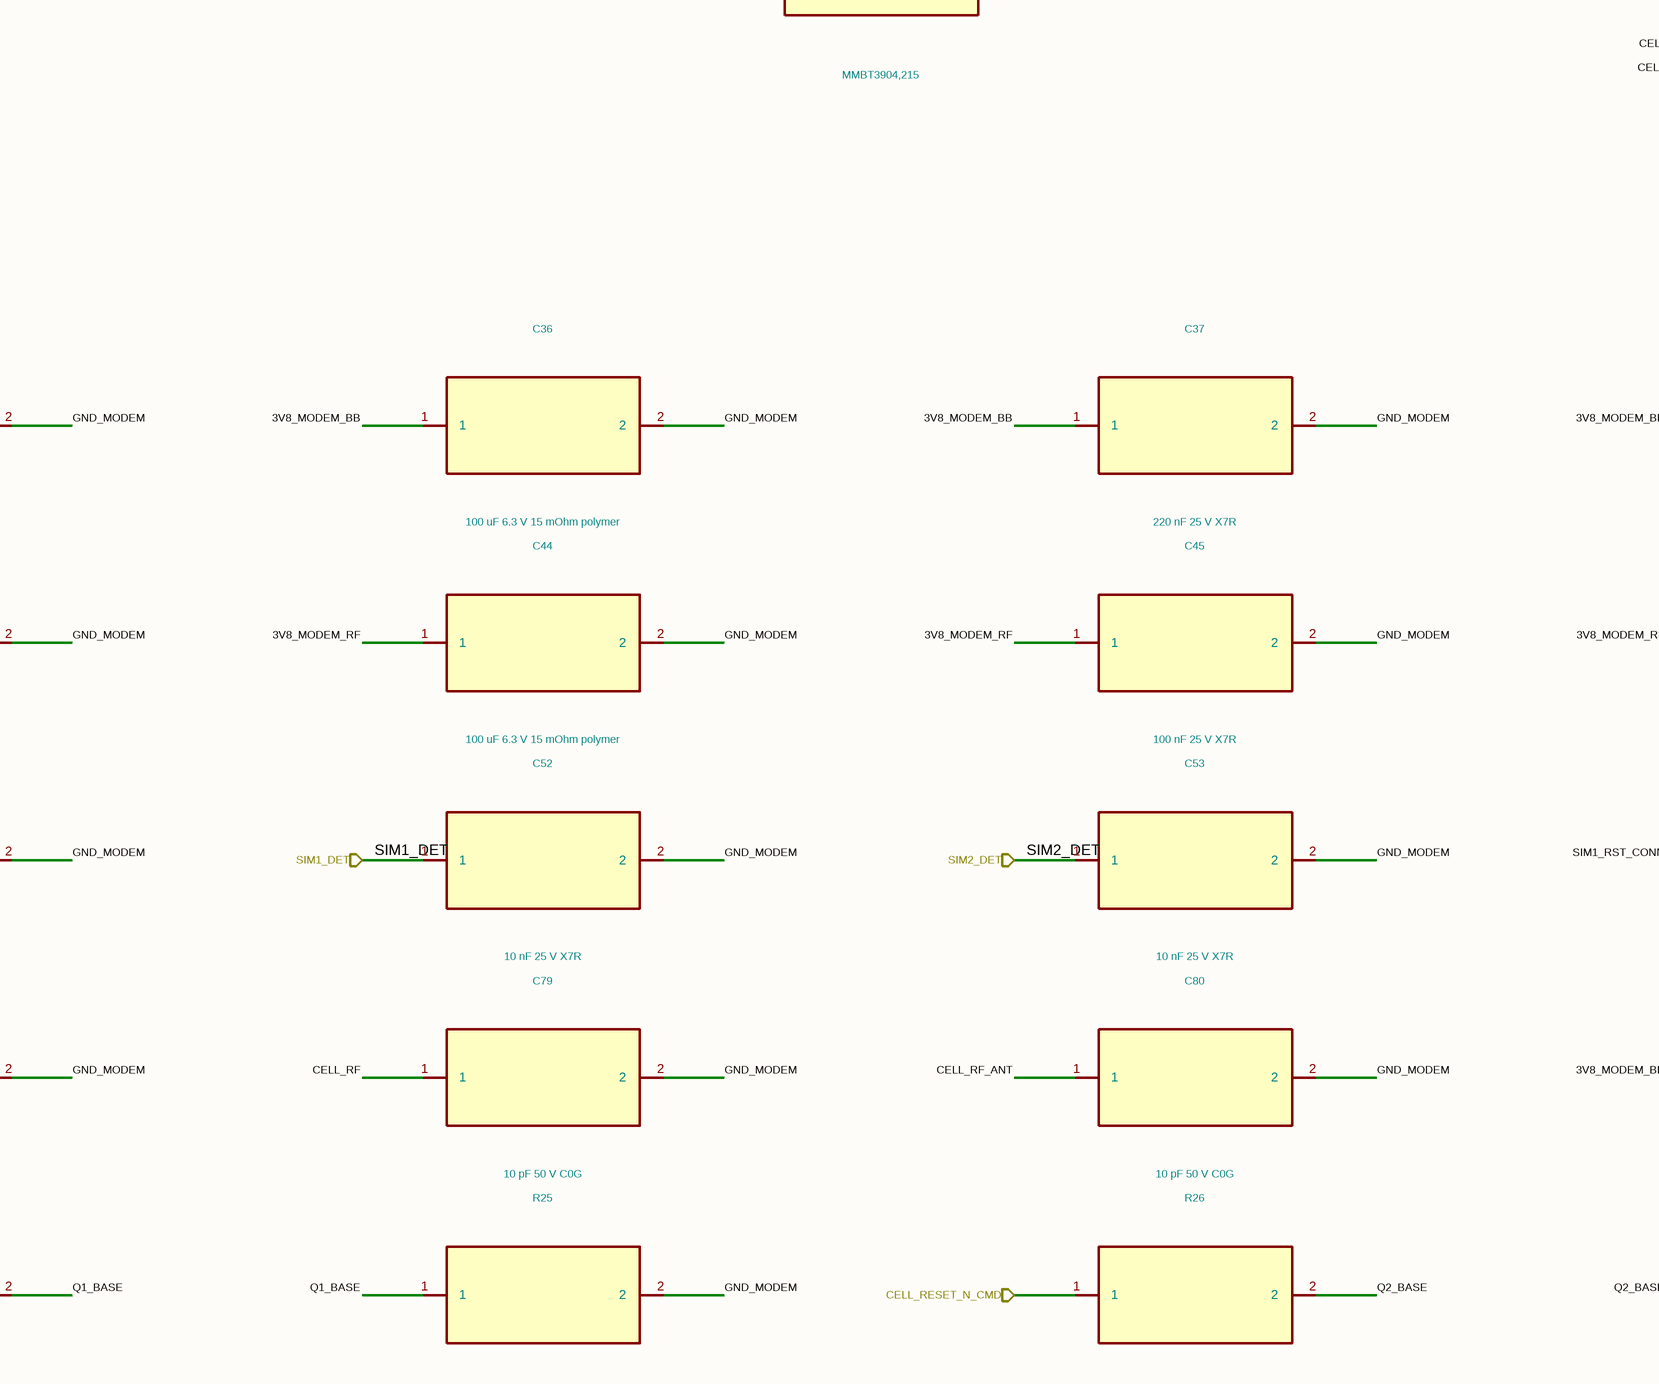
[diagram p33: PCB-MAIN_05_CELLULAR.SchDoc, centre middle]
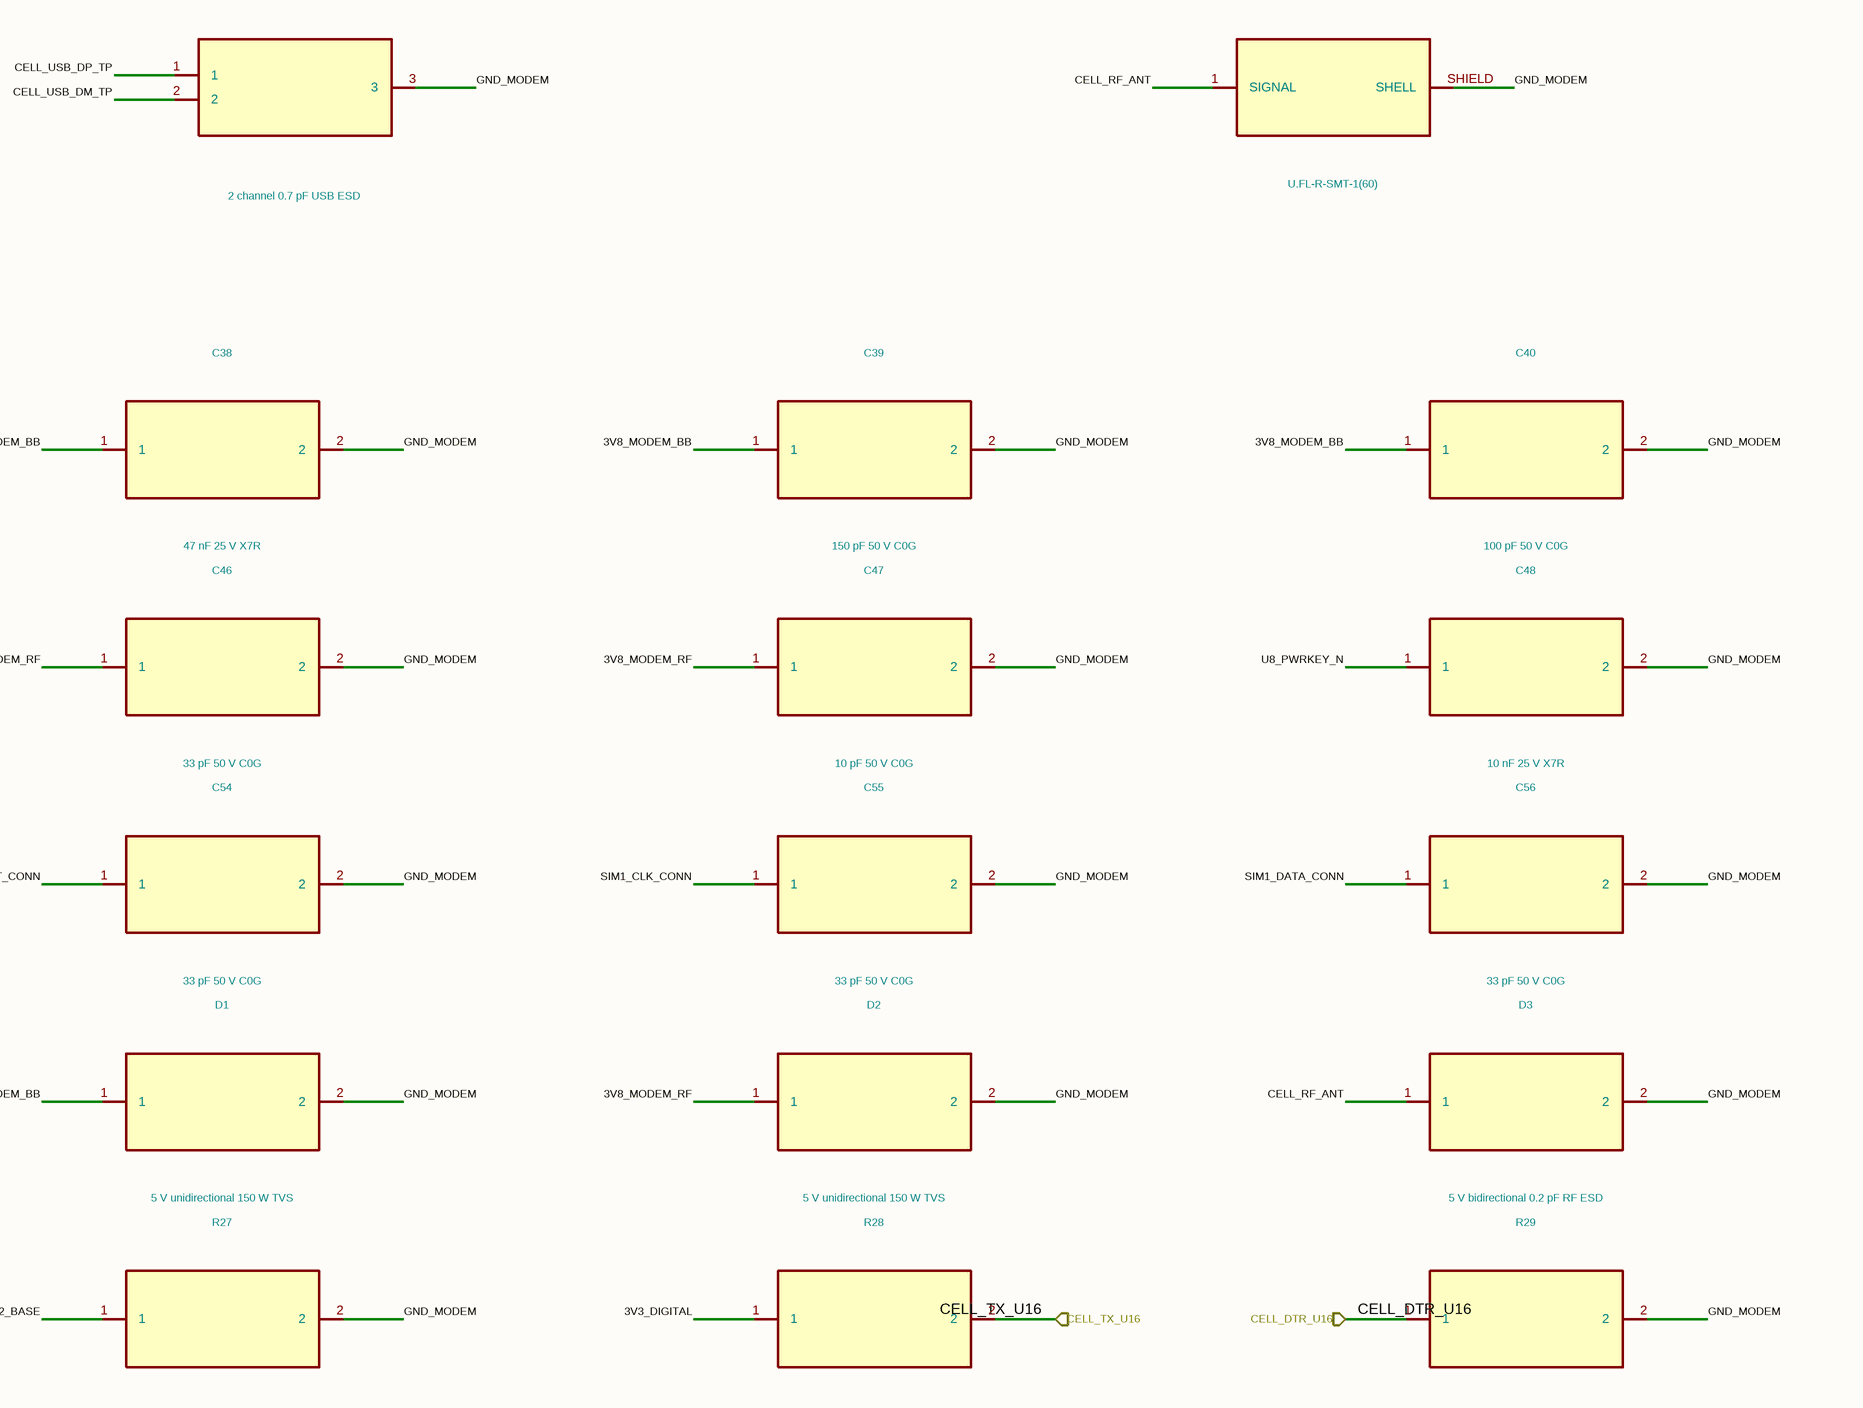
[diagram p34: PCB-MAIN_05_CELLULAR.SchDoc, centre right]
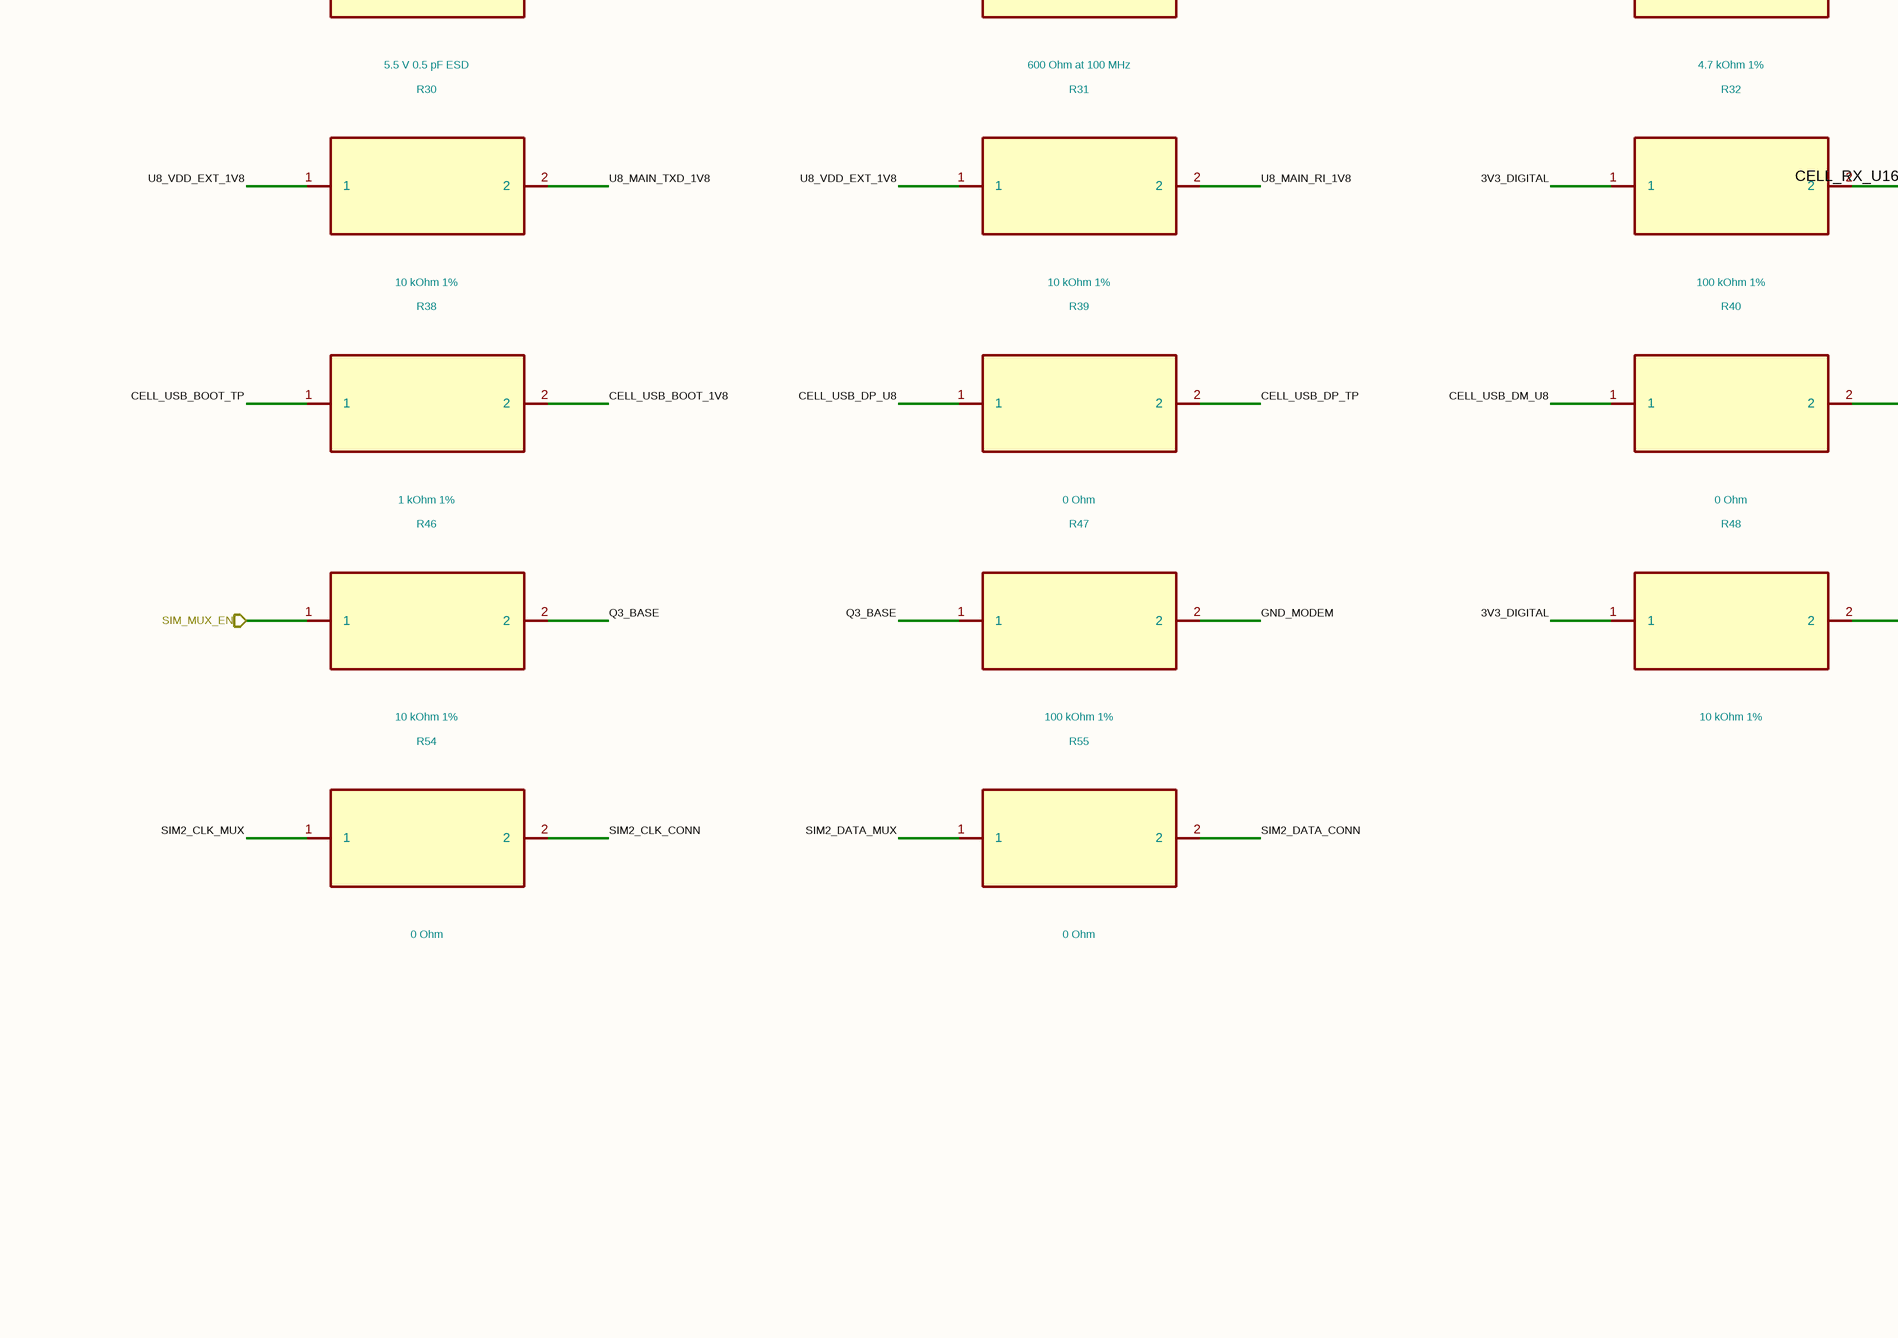
[diagram p35: PCB-MAIN_05_CELLULAR.SchDoc, bottom left]
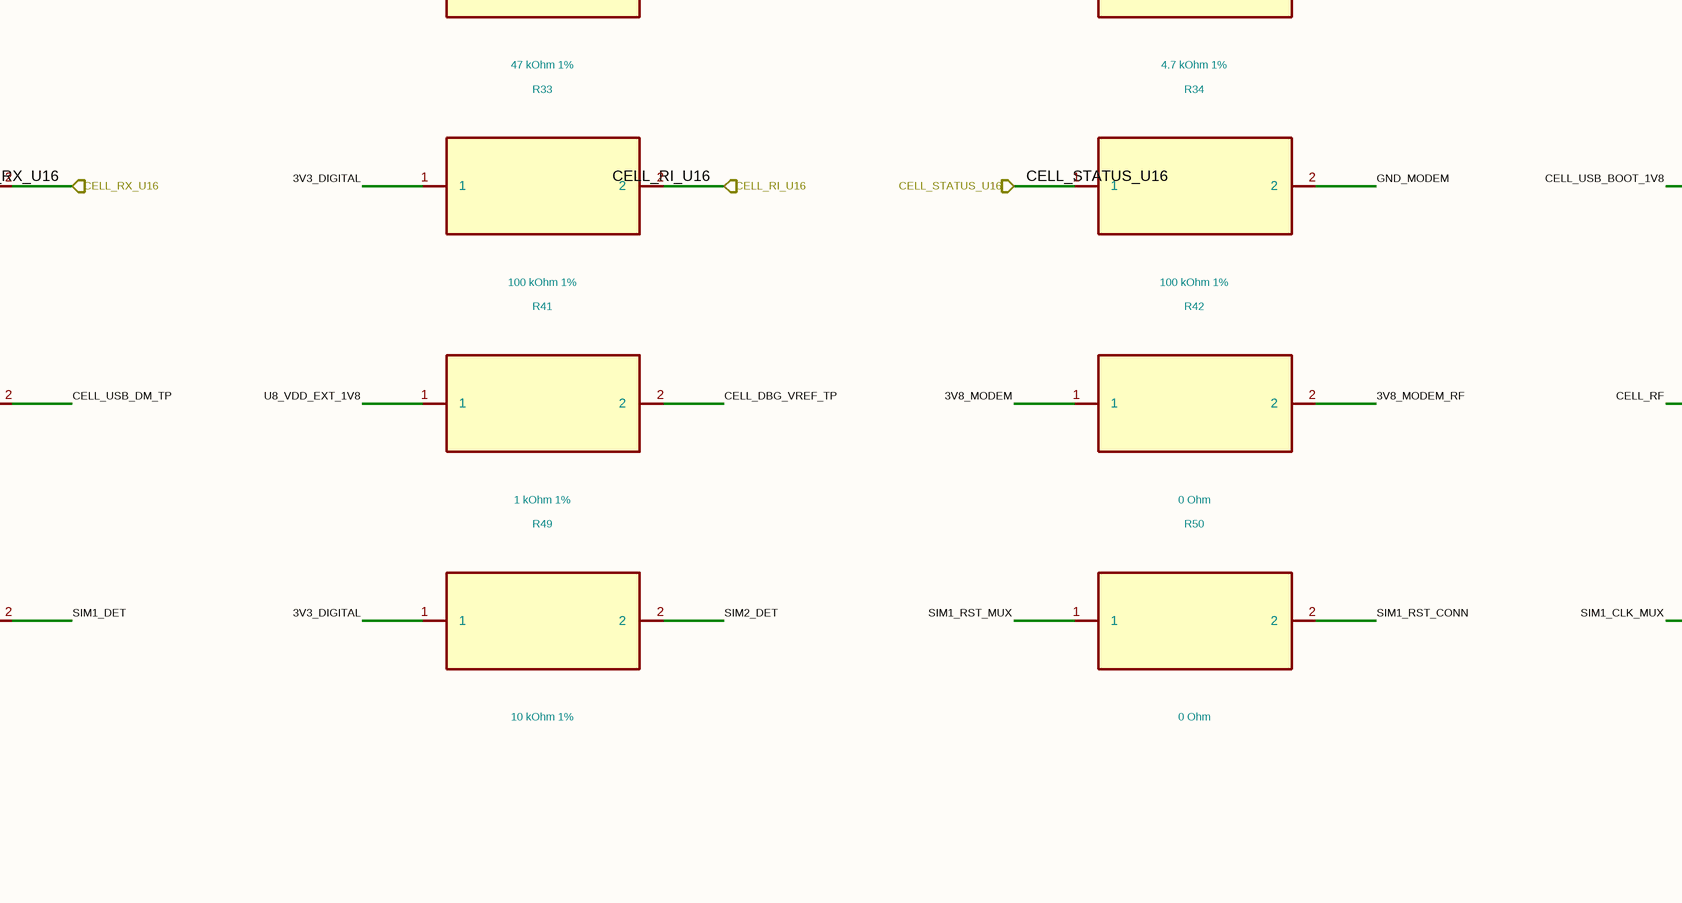
[diagram p36: PCB-MAIN_05_CELLULAR.SchDoc, bottom middle]
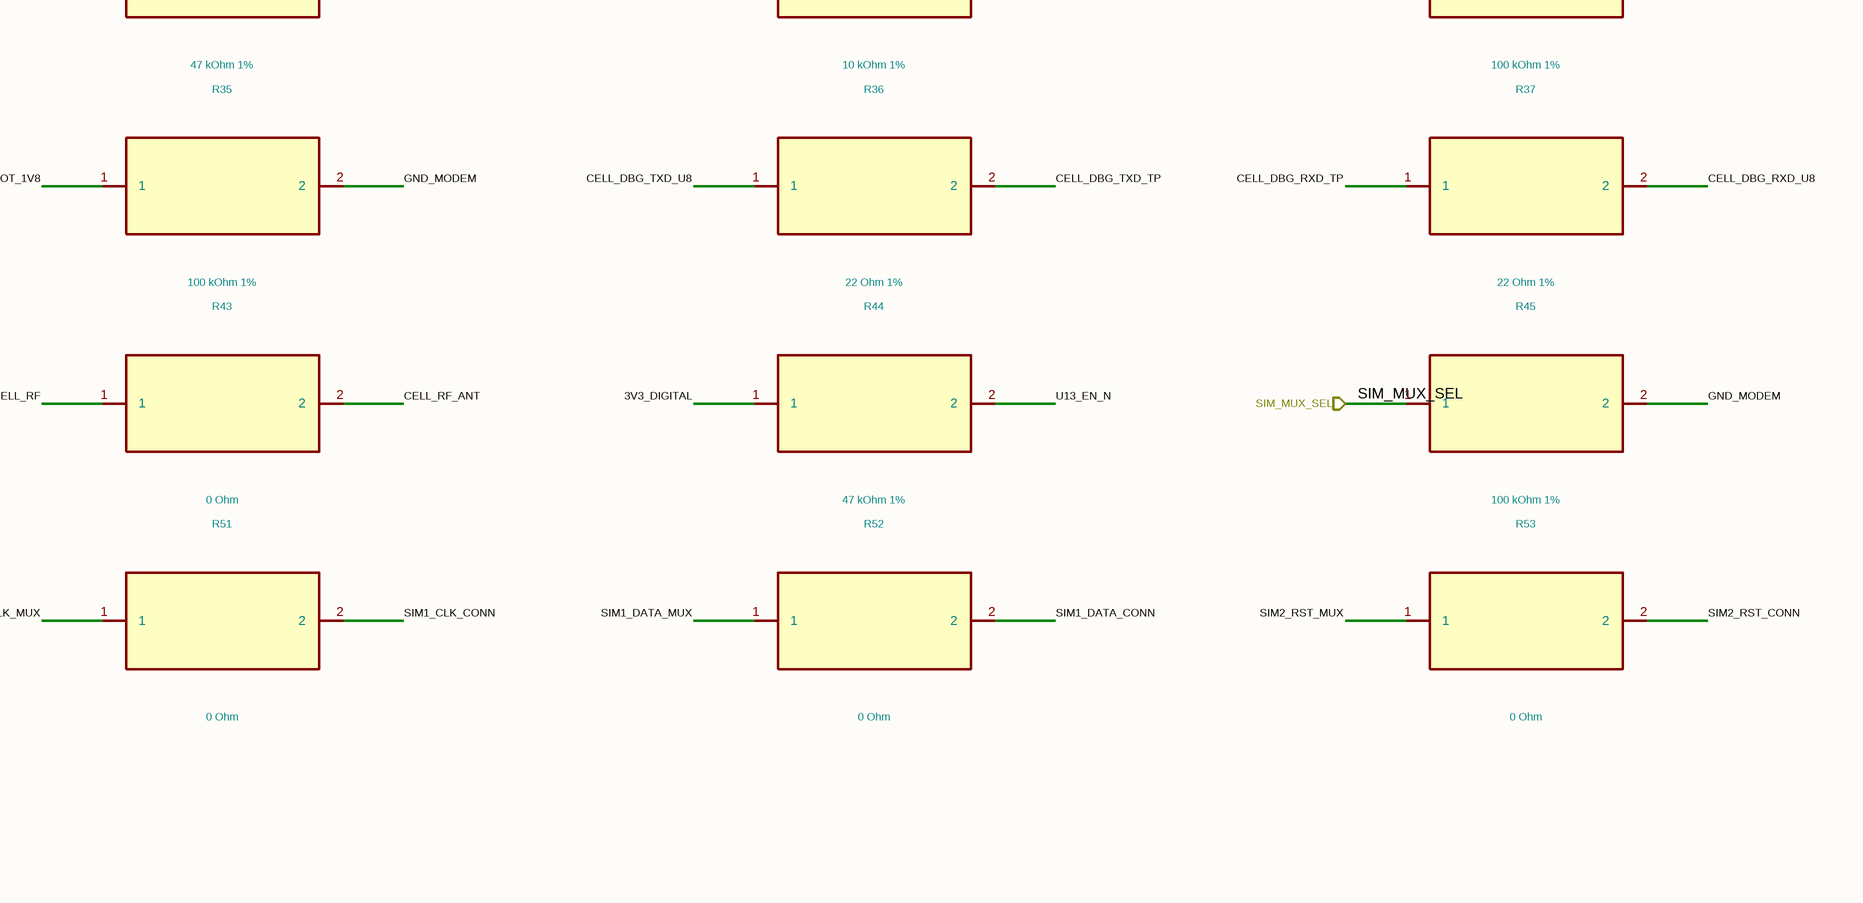
[diagram p37: PCB-MAIN_05_CELLULAR.SchDoc, bottom right]

### Parts
C33  100 nF 25 V X7R  [C_0402_1005Metric]
C34  100 nF 25 V X7R  [C_0402_1005Metric]
C35  100 nF 25 V X7R  [C_0402_1005Metric]
C36  100 uF 6.3 V 15 mOhm polymer
C37  220 nF 25 V X7R  [C_0402_1005Metric]
C38  47 nF 25 V X7R  [C_0402_1005Metric]
C39  150 pF 50 V C0G  [C_0402_1005Metric]
C40  100 pF 50 V C0G  [C_0402_1005Metric]
C41  68 pF 50 V C0G  [C_0402_1005Metric]
C42  33 pF 50 V C0G  [C_0402_1005Metric]
C43  10 pF 50 V C0G  [C_0402_1005Metric]
C44  100 uF 6.3 V 15 mOhm polymer
C45  100 nF 25 V X7R  [C_0402_1005Metric]
C46  33 pF 50 V C0G  [C_0402_1005Metric]
C47  10 pF 50 V C0G  [C_0402_1005Metric]
C48  10 nF 25 V X7R  [C_0402_1005Metric]
C49  100 nF 25 V X7R  [C_0402_1005Metric]
C50  100 nF 25 V X7R  [C_0402_1005Metric]
C51  100 nF 25 V X7R  [C_0402_1005Metric]
C52  10 nF 25 V X7R  [C_0402_1005Metric]
C53  10 nF 25 V X7R  [C_0402_1005Metric]
C54  33 pF 50 V C0G  [C_0402_1005Metric]
C55  33 pF 50 V C0G  [C_0402_1005Metric]
C56  33 pF 50 V C0G  [C_0402_1005Metric]
C57  33 pF 50 V C0G  [C_0402_1005Metric]
C58  33 pF 50 V C0G  [C_0402_1005Metric]
C59  33 pF 50 V C0G  [C_0402_1005Metric]
C79  10 pF 50 V C0G  [C_0402_1005Metric]
C80  10 pF 50 V C0G  [C_0402_1005Metric]
D1  5 V unidirectional 150 W TVS
D2  5 V unidirectional 150 W TVS
D3  5 V bidirectional 0.2 pF RF ESD
D10  5.5 V 0.5 pF ESD
FB1  600 Ohm at 100 MHz  [L_1206_3216Metric]
J6  2336582-1
J7  2336582-1
J8  U.FL-R-SMT-1(60)
Q1  MMBT3904,215
Q2  MMBT3904,215
Q3  MMBT3904,215
R24  4.7 kOhm 1%  [R_0402_1005Metric]
R25  47 kOhm 1%  [R_0402_1005Metric]
R26  4.7 kOhm 1%  [R_0402_1005Metric]
R27  47 kOhm 1%  [R_0402_1005Metric]
R28  10 kOhm 1%  [R_0402_1005Metric]
R29  100 kOhm 1%  [R_0402_1005Metric]
R30  10 kOhm 1%  [R_0402_1005Metric]
R31  10 kOhm 1%  [R_0402_1005Metric]
R32  100 kOhm 1%  [R_0402_1005Metric]
R33  100 kOhm 1%  [R_0402_1005Metric]
R34  100 kOhm 1%  [R_0402_1005Metric]
R35  100 kOhm 1%  [R_0402_1005Metric]
R36  22 Ohm 1%  [R_0402_1005Metric]
R37  22 Ohm 1%  [R_0402_1005Metric]
R38  1 kOhm 1%  [R_0402_1005Metric]
R39  0 Ohm  [R_0402_1005Metric]
R40  0 Ohm  [R_0402_1005Metric]
R41  1 kOhm 1%  [R_0402_1005Metric]
R42  0 Ohm  [R_0402_1005Metric]
R43  0 Ohm  [R_0402_1005Metric]
R44  47 kOhm 1%  [R_0402_1005Metric]
R45  100 kOhm 1%  [R_0402_1005Metric]
R46  10 kOhm 1%  [R_0402_1005Metric]
R47  100 kOhm 1%  [R_0402_1005Metric]
R48  10 kOhm 1%  [R_0402_1005Metric]
R49  10 kOhm 1%  [R_0402_1005Metric]
R50  0 Ohm  [R_0402_1005Metric]
R51  0 Ohm  [R_0402_1005Metric]
R52  0 Ohm  [R_0402_1005Metric]
R53  0 Ohm  [R_0402_1005Metric]
R54  0 Ohm  [R_0402_1005Metric]
R55  0 Ohm  [R_0402_1005Metric]
TP_CELL_DBG  TEST_PADS
TP_CELL_USB  TEST_PADS
U8  BG95-M3
U13  TS3A27518EPWR
U14  ESDALC6V1-5P6
U15  ESDALC6V1-5P6
U16  SN74AXC8T245PWR
U26  2 channel 0.7 pF USB ESD
U27  4 channel 0.5 pF ESD

### Ports
3V3_DIGITAL, 3V8_MODEM, CELL_DTR_U16, CELL_PWRKEY_CMD, CELL_RESET_N_CMD, CELL_RI_U16, CELL_RX_U16, CELL_STATUS_U16, CELL_TX_U16, GND_MODEM, SIM1_DET, SIM2_DET, SIM_MUX_EN, SIM_MUX_SEL

### Nets
3V3_DIGITAL: C34.1 C35.1 C49.1 R28.1 R32.1 R33.1 R44.1 R48.1 R49.1 U13.8(VCC) U16.23(VCCB) U16.24(VCCB) ; port 3V3_DIGITAL
3V8_MODEM: FB1.1 R42.1 ; port 3V8_MODEM
3V8_MODEM_BB: C36.1 C37.1 C38.1 C39.1 C40.1 C41.1 C42.1 C43.1 D1.1 FB1.2 U8.32(VBAT_BB) U8.33(VBAT_BB)
3V8_MODEM_RF: C44.1 C45.1 C46.1 C47.1 D2.1 R42.2 U8.52(VBAT_RF) U8.53(VBAT_RF)
CELL_DBG_RXD_TP: R37.1 TP_CELL_DBG.3(DUT_RX) U27.2
CELL_DBG_RXD_U8: R37.2 U8.22(DBG_RXD)
CELL_DBG_TXD_TP: R36.2 TP_CELL_DBG.2(DUT_TX) U27.1
CELL_DBG_TXD_U8: R36.1 U8.23(DBG_TXD)
CELL_DBG_VREF_TP: R41.2 U27.4
CELL_DTR_U16: R29.1 U16.16(B6) ; port CELL_DTR_U16
CELL_PWRKEY_CMD: R24.1 ; port CELL_PWRKEY_CMD
CELL_RESET_N_CMD: R26.1 ; port CELL_RESET_N_CMD
CELL_RF: C79.1 R43.1 U8.60(ANT_MAIN)
CELL_RF_ANT: C80.1 D3.1 J8.1(SIGNAL) R43.2
CELL_RI_U16: R33.2 U16.19(B3) ; port CELL_RI_U16
CELL_RX_U16: R32.2 U16.21(B1) ; port CELL_RX_U16
CELL_STATUS_U16: R34.1 U16.20(B2) ; port CELL_STATUS_U16
CELL_TX_U16: R28.2 U16.17(B5) ; port CELL_TX_U16
CELL_USB_BOOT_1V8: R35.1 R38.2 U8.75(USB_BOOT)
CELL_USB_BOOT_TP: R38.1 TP_CELL_DBG.4(USB_BOOT) U27.5
CELL_USB_DM_TP: R40.2 TP_CELL_USB.3(USB_DM) U26.2
CELL_USB_DM_U8: R40.1 U8.10(USB_DM)
CELL_USB_DP_TP: R39.2 TP_CELL_USB.2(USB_DP) U26.1
CELL_USB_DP_U8: R39.1 U8.9(USB_DP)
CELL_USB_VBUS: D10.1 TP_CELL_USB.1(HOST_VBUS) U8.8(USB_VBUS)
CELL_USIM_CLK_1V8: U8.46(USIM_CLK) U13.7(COM3)
CELL_USIM_DATA_1V8: U8.45(USIM_DATA) U13.10(COM5)
CELL_USIM_RST_1V8: U8.44(USIM_RST) U13.6(COM2)
CELL_USIM_VDD_1V8: U8.43(USIM_VDD) U13.4(COM1) U13.9(COM4) U13.12(COM6)
GND_MODEM: C33.2 C34.2 C35.2 C36.2 C37.2 C38.2 C39.2 C40.2 C41.2 C42.2 C43.2 C44.2 C45.2 C46.2 C47.2 C48.2 C49.2 C50.2 C51.2 C52.2 C53.2 C54.2 C55.2 C56.2 C57.2 C58.2 C59.2 C79.2 C80.2 D1.2 D2.2 D3.2 D10.2 J6.4(C5_GND) J6.SHIELD(SHELL) J7.4(C5_GND) J7.SHIELD(SHELL) J8.SHIELD(SHELL) Q1.2(E) Q2.2(E) Q3.2(E) R25.2 R27.2 R29.2 R34.2 R35.2 R45.2 R47.2 TP_CELL_DBG.5(GND) TP_CELL_USB.4(GND) U8.3(GND) U8.31(GND) U8.47(USIM_GND) U8.48(GND) U8.50(GND) U8.54(GND) U8.55(GND) U8.58(GND) U8.59(GND) U8.61(GND) U8.62(GND) U8.67(GND) U8.68(GND) U8.69(GND) U8.70(GND) U8.71(GND) U8.72(GND) U8.73(GND) U8.74(GND) U8.79(GND) U8.80(GND) U8.81(GND) U8.82(GND) U8.89(GND) U8.90(GND) U8.91(GND) U8.100(GND) U8.101(GND) U8.102(GND) U13.5(GND) U14.2(GND) U15.2(GND) U16.6(A4) U16.11(DIR2) U16.12(GND) U16.13(GND) U16.14(B8) U16.15(B7) U16.22(OE) U26.3 U27.3 U27.8 ; port GND_MODEM
Q1_BASE: Q1.1(B) R24.2 R25.1
Q2_BASE: Q2.1(B) R26.2 R27.1
Q3_BASE: Q3.1(B) R46.2 R47.1
SIM1_CLK_CONN: C55.1 J6.3(C3_CLK) R51.2 U14.4(I/O3)
SIM1_CLK_MUX: R51.1 U13.23(NC3)
SIM1_DATA_CONN: C56.1 J6.6(C7_IO) R52.2 U14.5(I/O4)
SIM1_DATA_MUX: R52.1 U13.19(NC5)
SIM1_DET: C52.1 J6.7(CD) R48.2 U14.6(I/O5) ; port SIM1_DET
SIM1_RST_CONN: C54.1 J6.2(C2_RST) R50.2 U14.3(I/O2)
SIM1_RST_MUX: R50.1 U13.1(NC2)
SIM1_VDD_CONN: C50.1 J6.1(C1_VCC) U13.2(NC1) U13.21(NC4) U13.22(NC6) U14.1(I/O1)
SIM2_CLK_CONN: C58.1 J7.3(C3_CLK) R54.2 U15.4(I/O3)
SIM2_CLK_MUX: R54.1 U13.15(NO3)
SIM2_DATA_CONN: C59.1 J7.6(C7_IO) R55.2 U15.5(I/O4)
SIM2_DATA_MUX: R55.1 U13.18(NO5)
SIM2_DET: C53.1 J7.7(CD) R49.2 U15.6(I/O5) ; port SIM2_DET
SIM2_RST_CONN: C57.1 J7.2(C2_RST) R53.2 U15.3(I/O2)
SIM2_RST_MUX: R53.1 U13.13(NO2)
SIM2_VDD_CONN: C51.1 J7.1(C1_VCC) U13.11(NO1) U13.16(NO6) U13.17(NO4) U15.1(I/O1)
SIM_MUX_EN: R46.1 ; port SIM_MUX_EN
SIM_MUX_SEL: R45.1 U13.14(IN2) U13.24(IN1) ; port SIM_MUX_SEL
U8_MAIN_DTR_1V8: U8.30(MAIN_DTR) U16.8(A6)
U8_MAIN_RI_1V8: R31.2 U8.39(MAIN_RI) U16.5(A3)
U8_MAIN_RXD_1V8: U8.34(MAIN_RXD) U16.7(A5)
U8_MAIN_TXD_1V8: R30.2 U8.35(MAIN_TXD) U16.3(A1)
U8_PWRKEY_N: C48.1 Q1.3(C) U8.15(PWRKEY)
U8_RESET_N: Q2.3(C) U8.17(RESET_N)
U8_STATUS_1V8: U8.20(STATUS) U16.4(A2)
U8_VDD_EXT_1V8: C33.1 R30.1 R31.1 R41.1 TP_CELL_DBG.1(VREF_1V8) U8.29(VDD_EXT) U16.1(VCCA) U16.2(DIR1)
U13_EN_N: Q3.3(C) R44.2 U13.20(EN)

Not connected (* = marked no-connect by the designer): J6 5(C6_VPP)*; J7 5(C6_VPP)*; U8 1(PSM_IND)* 2(ADC1)* 4(PCM_CLK)* 5(PCM_SYNC)* 6(PCM_DIN)* 7(PCM_DOUT)* 11(RESERVED)* 12(RESERVED)* 13(RESERVED)* 14(RESERVED)* 16(RESERVED)* 18(W_DISABLE#)* 19(AP_READY)* 21(NET_STATUS)* 24(ADC0)* 25(GPIO1)* 26(GPIO2)* 27(GNSS_TXD)* 28(GNSS_RXD)* 36(MAIN_CTS)* 37(MAIN_RTS)* 38(MAIN_DCD)* 40(I2C_SCL)* 41(I2C_SDA)* 42(USIM_DET)* 49(ANT_GNSS)* 51(GNSS_LNA_EN)* 56(ANT_WIFI)* 57(RESERVED)* 63(RESERVED)* 64(GPIO3)* 65(GPIO4)* 66(GPIO5)* 76(RESERVED)* 77(RESERVED)* 78(RESERVED)* 83(GRFC1)* 84(GRFC2)* 85(GPIO6)* 86(GPIO7)* 87(GPIO8)* 88(GPIO9)* 92(RESERVED)* 93(RESERVED)* 94(RESERVED)* 95(RESERVED)* 96(PON_TRIG)* 97(RESERVED)* 98(RESERVED)* 99(RESERVED)*; U13 3(N.C.)*; U16 9(A7)* 10(A8)* 18(B4)*; U27 6* 7* 9* 10*

### Notes on the sheet
- Every connected symbol pin has one explicit wire stub. Only hierarchical labels cross functional-sheet boundaries.
- 1
- 2
- 3
- 4
- 5
- 6
- 7
- 8
- 9
- 10
- 11
- A
- B
- C
- D
- E
- F
- G
- H
- Human-readable hierarchy candidate; exact Review-A pin/net equivalence enforced
- Functional sheet 6 of 10
- NOT FOR MANUFACTURE - hierarchy review/routing/DRC/DFM/Review B pending
- Title: Dioneya PCB-MAIN Rev.A - Cellular + dual SIM
- File: PCB-MAIN_05_CELLULAR.kicad_sch
- Sheet: /
- Dioneya / ZS-BPLA
- KiCad E.D.A.  kicad (5.1.4)-1
- Size: A2
- Date: 2026-09-16
- Rev: A
- Id: 1/1

### Library data of the parts
C33 = C33_GRM155R71E104KE14D: Manufacturer: Murata; Population: FITTED; Authority: TI_SCES875C_RevC; MPN: GRM155R71E104KE14D; Package: 0402; Value: 100 nF 25 V X7R; Footprint: Capacitor_SMD:C_0402_1005Metric
C34 = C34_GRM155R71E104KE14D: Manufacturer: Murata; Population: FITTED; Authority: TI_SCES875C_RevC; MPN: GRM155R71E104KE14D; Package: 0402; Value: 100 nF 25 V X7R; Footprint: Capacitor_SMD:C_0402_1005Metric
C35 = C35_GRM155R71E104KE14D: Manufacturer: Murata; Population: FITTED; Authority: TI_SCES875C_RevC; MPN: GRM155R71E104KE14D; Package: 0402; Value: 100 nF 25 V X7R; Footprint: Capacitor_SMD:C_0402_1005Metric
C36 = C36_T520D107M006ATE015: Manufacturer: KEMET; Population: FITTED; Authority: Quectel_BG95_HW_Design_v1.6; MPN: T520D107M006ATE015; Package: 7343-31; Value: 100 uF 6.3 V 15 mOhm polymer
C37 = C37_GRM155R71E224KE14D: Manufacturer: Murata; Population: FITTED; Authority: Quectel_BG95_HW_Design_v1.6; MPN: GRM155R71E224KE14D; Package: 0402; Value: 220 nF 25 V X7R; Footprint: Capacitor_SMD:C_0402_1005Metric
C38 = C38_GRM155R71E473KA01D: Manufacturer: Murata; Population: FITTED; Authority: Quectel_BG95_HW_Design_v1.6; MPN: GRM155R71E473KA01D; Package: 0402; Value: 47 nF 25 V X7R; Footprint: Capacitor_SMD:C_0402_1005Metric
C39 = C39_GRM1555C1H151JA01D: Manufacturer: Murata; Population: FITTED; Authority: Quectel_BG95_HW_Design_v1.6; MPN: GRM1555C1H151JA01D; Package: 0402; Value: 150 pF 50 V C0G; Footprint: Capacitor_SMD:C_0402_1005Metric
C40 = C40_GRM1555C1H101JA01D: Manufacturer: Murata; Population: FITTED; Authority: Quectel_BG95_HW_Design_v1.6; MPN: GRM1555C1H101JA01D; Package: 0402; Value: 100 pF 50 V C0G; Footprint: Capacitor_SMD:C_0402_1005Metric
C41 = C41_GRM1555C1H680JA01D: Manufacturer: Murata; Population: FITTED; Authority: Quectel_BG95_HW_Design_v1.6; MPN: GRM1555C1H680JA01D; Package: 0402; Value: 68 pF 50 V C0G; Footprint: Capacitor_SMD:C_0402_1005Metric
C42 = C42_GRM1555C1H330JA01D: Manufacturer: Murata; Population: FITTED; Authority: Quectel_BG95_HW_Design_v1.6; MPN: GRM1555C1H330JA01D; Package: 0402; Value: 33 pF 50 V C0G; Footprint: Capacitor_SMD:C_0402_1005Metric
C43 = C43_GRM1555C1H100JA01D: Manufacturer: Murata; Population: FITTED; Authority: Quectel_BG95_HW_Design_v1.6; MPN: GRM1555C1H100JA01D; Package: 0402; Value: 10 pF 50 V C0G; Footprint: Capacitor_SMD:C_0402_1005Metric
C44 = C44_T520D107M006ATE015: Manufacturer: KEMET; Population: FITTED; Authority: Quectel_BG95_HW_Design_v1.6; MPN: T520D107M006ATE015; Package: 7343-31; Value: 100 uF 6.3 V 15 mOhm polymer
C45 = C45_GRM155R71E104KE14D: Manufacturer: Murata; Population: FITTED; Authority: Quectel_BG95_HW_Design_v1.6; MPN: GRM155R71E104KE14D; Package: 0402; Value: 100 nF 25 V X7R; Footprint: Capacitor_SMD:C_0402_1005Metric
C46 = C46_GRM1555C1H330JA01D: Manufacturer: Murata; Population: FITTED; Authority: Quectel_BG95_HW_Design_v1.6; MPN: GRM1555C1H330JA01D; Package: 0402; Value: 33 pF 50 V C0G; Footprint: Capacitor_SMD:C_0402_1005Metric
C47 = C47_GRM1555C1H100JA01D: Manufacturer: Murata; Population: FITTED; Authority: Quectel_BG95_HW_Design_v1.6; MPN: GRM1555C1H100JA01D; Package: 0402; Value: 10 pF 50 V C0G; Footprint: Capacitor_SMD:C_0402_1005Metric
C48 = C48_GRM155R71E103KA01D: Manufacturer: Murata; Population: FITTED; Authority: Quectel_BG95_HW_Design_v1.6; MPN: GRM155R71E103KA01D; Package: 0402; Value: 10 nF 25 V X7R; Footprint: Capacitor_SMD:C_0402_1005Metric
C49 = C49_GRM155R71E104KE14D: Manufacturer: Murata; Population: FITTED; Authority: TI_TS3A27518E_SCDS260F; MPN: GRM155R71E104KE14D; Package: 0402; Value: 100 nF 25 V X7R; Footprint: Capacitor_SMD:C_0402_1005Metric
C50 = C50_GRM155R71E104KE14D: Manufacturer: Murata; Population: FITTED; Authority: Quectel_BG95_HW_Design_v1.6; MPN: GRM155R71E104KE14D; Package: 0402; Value: 100 nF 25 V X7R; Footprint: Capacitor_SMD:C_0402_1005Metric
C51 = C51_GRM155R71E104KE14D: Manufacturer: Murata; Population: FITTED; Authority: Quectel_BG95_HW_Design_v1.6; MPN: GRM155R71E104KE14D; Package: 0402; Value: 100 nF 25 V X7R; Footprint: Capacitor_SMD:C_0402_1005Metric
C52 = C52_GRM155R71E103KA01D: Manufacturer: Murata; Population: FITTED; Authority: TE_C-2336582_A2; MPN: GRM155R71E103KA01D; Package: 0402; Value: 10 nF 25 V X7R; Footprint: Capacitor_SMD:C_0402_1005Metric
C53 = C53_GRM155R71E103KA01D: Manufacturer: Murata; Population: FITTED; Authority: TE_C-2336582_A2; MPN: GRM155R71E103KA01D; Package: 0402; Value: 10 nF 25 V X7R; Footprint: Capacitor_SMD:C_0402_1005Metric
C54 = C54_GRM1555C1H330JA01D: Manufacturer: Murata; Population: DNP; Authority: Quectel_BG95_HW_Design_v1.6; MPN: GRM1555C1H330JA01D; Package: 0402; Value: 33 pF 50 V C0G; Footprint: Capacitor_SMD:C_0402_1005Metric
C55 = C55_GRM1555C1H330JA01D: Manufacturer: Murata; Population: DNP; Authority: Quectel_BG95_HW_Design_v1.6; MPN: GRM1555C1H330JA01D; Package: 0402; Value: 33 pF 50 V C0G; Footprint: Capacitor_SMD:C_0402_1005Metric
C56 = C56_GRM1555C1H330JA01D: Manufacturer: Murata; Population: DNP; Authority: Quectel_BG95_HW_Design_v1.6; MPN: GRM1555C1H330JA01D; Package: 0402; Value: 33 pF 50 V C0G; Footprint: Capacitor_SMD:C_0402_1005Metric
C57 = C57_GRM1555C1H330JA01D: Manufacturer: Murata; Population: DNP; Authority: Quectel_BG95_HW_Design_v1.6; MPN: GRM1555C1H330JA01D; Package: 0402; Value: 33 pF 50 V C0G; Footprint: Capacitor_SMD:C_0402_1005Metric
C58 = C58_GRM1555C1H330JA01D: Manufacturer: Murata; Population: DNP; Authority: Quectel_BG95_HW_Design_v1.6; MPN: GRM1555C1H330JA01D; Package: 0402; Value: 33 pF 50 V C0G; Footprint: Capacitor_SMD:C_0402_1005Metric
C59 = C59_GRM1555C1H330JA01D: Manufacturer: Murata; Population: DNP; Authority: Quectel_BG95_HW_Design_v1.6; MPN: GRM1555C1H330JA01D; Package: 0402; Value: 33 pF 50 V C0G; Footprint: Capacitor_SMD:C_0402_1005Metric
C79 = C79_GRM1555C1H100JA01D: Manufacturer: Murata; Population: DNP; Authority: Quectel_BG95_HW_Design_v1.6; MPN: GRM1555C1H100JA01D; Package: 0402; Value: 10 pF 50 V C0G; Footprint: Capacitor_SMD:C_0402_1005Metric
C80 = C80_GRM1555C1H100JA01D: Manufacturer: Murata; Population: DNP; Authority: Quectel_BG95_HW_Design_v1.6; MPN: GRM1555C1H100JA01D; Package: 0402; Value: 10 pF 50 V C0G; Footprint: Capacitor_SMD:C_0402_1005Metric
D1 = D1_PESD5V0S1UL: Manufacturer: Nexperia; Population: FITTED; Authority: Nexperia_PESD5V0S1UL_v5; MPN: PESD5V0S1UL; Package: SOD882; Value: 5 V unidirectional 150 W TVS
D2 = D2_PESD5V0S1UL: Manufacturer: Nexperia; Population: FITTED; Authority: Nexperia_PESD5V0S1UL_v5; MPN: PESD5V0S1UL; Package: SOD882; Value: 5 V unidirectional 150 W TVS
D3 = D3_PESD5V0C1BSF: Manufacturer: Nexperia; Population: FITTED; Authority: Nexperia_PESD5V0C1BSF_v3; MPN: PESD5V0C1BSF; Package: SOD962-2; Value: 5 V bidirectional 0.2 pF RF ESD
D10 = D10_TPD1E05U06DYAR: Manufacturer: Texas Instruments; Population: FITTED; Authority: TI_TPDxE05U06_RevO; MPN: TPD1E05U06DYAR; Package: SOD-523_DYA; Value: 5.5 V 0.5 pF ESD
FB1 = FB1_BLM31KN601SN1L: Manufacturer: Murata; Population: FITTED; Authority: Quectel_BG95_HW_Design_v1.6; MPN: BLM31KN601SN1L; Package: 1206; Value: 600 Ohm at 100 MHz; Footprint: Inductor_SMD:L_1206_3216Metric
J6 = J6_2336582-1: Manufacturer: CONTROLLED_AUTHORITY; Population: FITTED; Authority: PCB_MAIN_DUAL_SIM_PIN_AUTHORITY_REV_A.csv; MPN: 2336582-1; Package: TE_NanoSIM_H1.37; Value: 2336582-1
J7 = J7_2336582-1: Manufacturer: CONTROLLED_AUTHORITY; Population: FITTED; Authority: PCB_MAIN_DUAL_SIM_PIN_AUTHORITY_REV_A.csv; MPN: 2336582-1; Package: TE_NanoSIM_H1.37; Value: 2336582-1
J8 = J8_U.FL-R-SMT-1_60: Manufacturer: CONTROLLED_AUTHORITY; Population: FITTED; Authority: PCB_MAIN_CONNECTOR_FIXTURE_PIN_AUTHORITY_REV_A.csv; MPN: U.FL-R-SMT-1(60); Package: U.FL_SMT; Value: U.FL-R-SMT-1(60)
Q1 = Q1_MMBT3904_215: Manufacturer: Nexperia; Population: FITTED; Authority: PCB_MAIN_CELLULAR_PIN_AUTHORITY_REV_A.csv; MPN: MMBT3904,215; Package: SOT23; Value: MMBT3904,215
Q2 = Q2_MMBT3904_215: Manufacturer: Nexperia; Population: FITTED; Authority: PCB_MAIN_CELLULAR_PIN_AUTHORITY_REV_A.csv; MPN: MMBT3904,215; Package: SOT23; Value: MMBT3904,215
Q3 = Q3_MMBT3904_215: Manufacturer: Nexperia; Population: FITTED; Authority: PCB_MAIN_DUAL_SIM_PIN_AUTHORITY_REV_A.csv; MPN: MMBT3904,215; Package: SOT23; Value: MMBT3904,215
R24 = R24_ERJ-2RKF4701X: Manufacturer: Panasonic; Population: FITTED; Authority: Quectel_BG95_HW_Design_v1.6; MPN: ERJ-2RKF4701X; Package: 0402; Value: 4.7 kOhm 1%; Footprint: Resistor_SMD:R_0402_1005Metric
R25 = R25_ERJ-2RKF4702X: Manufacturer: Panasonic; Population: FITTED; Authority: Quectel_BG95_HW_Design_v1.6; MPN: ERJ-2RKF4702X; Package: 0402; Value: 47 kOhm 1%; Footprint: Resistor_SMD:R_0402_1005Metric
R26 = R26_ERJ-2RKF4701X: Manufacturer: Panasonic; Population: FITTED; Authority: Quectel_BG95_HW_Design_v1.6; MPN: ERJ-2RKF4701X; Package: 0402; Value: 4.7 kOhm 1%; Footprint: Resistor_SMD:R_0402_1005Metric
R27 = R27_ERJ-2RKF4702X: Manufacturer: Panasonic; Population: FITTED; Authority: Quectel_BG95_HW_Design_v1.6; MPN: ERJ-2RKF4702X; Package: 0402; Value: 47 kOhm 1%; Footprint: Resistor_SMD:R_0402_1005Metric
R28 = R28_ERJ-2RKF1002X: Manufacturer: Panasonic; Population: FITTED; Authority: Quectel_BG95_HW_Design_v1.6; MPN: ERJ-2RKF1002X; Package: 0402; Value: 10 kOhm 1%; Footprint: Resistor_SMD:R_0402_1005Metric
R29 = R29_ERJ-2RKF1003X: Manufacturer: Panasonic; Population: FITTED; Authority: Quectel_BG95_HW_Design_v1.6; MPN: ERJ-2RKF1003X; Package: 0402; Value: 100 kOhm 1%; Footprint: Resistor_SMD:R_0402_1005Metric
R30 = R30_ERJ-2RKF1002X: Manufacturer: Panasonic; Population: FITTED; Authority: Quectel_BG95_HW_Design_v1.6; MPN: ERJ-2RKF1002X; Package: 0402; Value: 10 kOhm 1%; Footprint: Resistor_SMD:R_0402_1005Metric
R31 = R31_ERJ-2RKF1002X: Manufacturer: Panasonic; Population: FITTED; Authority: Quectel_BG95_HW_Design_v1.6; MPN: ERJ-2RKF1002X; Package: 0402; Value: 10 kOhm 1%; Footprint: Resistor_SMD:R_0402_1005Metric
R32 = R32_ERJ-2RKF1003X: Manufacturer: Panasonic; Population: FITTED; Authority: Quectel_BG95_HW_Design_v1.6; MPN: ERJ-2RKF1003X; Package: 0402; Value: 100 kOhm 1%; Footprint: Resistor_SMD:R_0402_1005Metric
R33 = R33_ERJ-2RKF1003X: Manufacturer: Panasonic; Population: FITTED; Authority: Quectel_BG95_HW_Design_v1.6; MPN: ERJ-2RKF1003X; Package: 0402; Value: 100 kOhm 1%; Footprint: Resistor_SMD:R_0402_1005Metric
R34 = R34_ERJ-2RKF1003X: Manufacturer: Panasonic; Population: FITTED; Authority: Quectel_BG95_HW_Design_v1.6; MPN: ERJ-2RKF1003X; Package: 0402; Value: 100 kOhm 1%; Footprint: Resistor_SMD:R_0402_1005Metric
R35 = R35_ERJ-2RKF1003X: Manufacturer: Panasonic; Population: FITTED; Authority: Quectel_BG95_HW_Design_v1.6; MPN: ERJ-2RKF1003X; Package: 0402; Value: 100 kOhm 1%; Footprint: Resistor_SMD:R_0402_1005Metric
R36 = R36_ERJ-2RKF22R0X: Manufacturer: Panasonic; Population: FITTED; Authority: PROJECT_MAIN_AUTH_010; MPN: ERJ-2RKF22R0X; Package: 0402; Value: 22 Ohm 1%; Footprint: Resistor_SMD:R_0402_1005Metric
R37 = R37_ERJ-2RKF22R0X: Manufacturer: Panasonic; Population: FITTED; Authority: PROJECT_MAIN_AUTH_010; MPN: ERJ-2RKF22R0X; Package: 0402; Value: 22 Ohm 1%; Footprint: Resistor_SMD:R_0402_1005Metric
R38 = R38_ERJ-2RKF1001X: Manufacturer: Panasonic; Population: FITTED; Authority: Quectel_BG95_HW_Design_v1.6; MPN: ERJ-2RKF1001X; Package: 0402; Value: 1 kOhm 1%; Footprint: Resistor_SMD:R_0402_1005Metric
R39 = R39_ERJ-2GE0R00X: Manufacturer: Panasonic; Population: FITTED; Authority: Quectel_BG95_HW_Design_v1.6; MPN: ERJ-2GE0R00X; Package: 0402; Value: 0 Ohm; Footprint: Resistor_SMD:R_0402_1005Metric
R40 = R40_ERJ-2GE0R00X: Manufacturer: Panasonic; Population: FITTED; Authority: Quectel_BG95_HW_Design_v1.6; MPN: ERJ-2GE0R00X; Package: 0402; Value: 0 Ohm; Footprint: Resistor_SMD:R_0402_1005Metric
R41 = R41_ERJ-2RKF1001X: Manufacturer: Panasonic; Population: FITTED; Authority: PROJECT_MAIN_AUTH_010; MPN: ERJ-2RKF1001X; Package: 0402; Value: 1 kOhm 1%; Footprint: Resistor_SMD:R_0402_1005Metric
R42 = R42_ERJ-2GE0R00X: Manufacturer: Panasonic; Population: FITTED; Authority: Quectel_BG95_HW_Design_v1.6; MPN: ERJ-2GE0R00X; Package: 0402; Value: 0 Ohm; Footprint: Resistor_SMD:R_0402_1005Metric
R43 = R43_ERJ-2GE0R00X: Manufacturer: Panasonic; Population: FITTED; Authority: Quectel_BG95_HW_Design_v1.6; MPN: ERJ-2GE0R00X; Package: 0402; Value: 0 Ohm; Footprint: Resistor_SMD:R_0402_1005Metric
R44 = R44_ERJ-2RKF4702X: Manufacturer: Panasonic; Population: FITTED; Authority: TI_TS3A27518E_SCDS260F; MPN: ERJ-2RKF4702X; Package: 0402; Value: 47 kOhm 1%; Footprint: Resistor_SMD:R_0402_1005Metric
R45 = R45_ERJ-2RKF1003X: Manufacturer: Panasonic; Population: FITTED; Authority: TI_TS3A27518E_SCDS260F; MPN: ERJ-2RKF1003X; Package: 0402; Value: 100 kOhm 1%; Footprint: Resistor_SMD:R_0402_1005Metric
R46 = R46_ERJ-2RKF1002X: Manufacturer: Panasonic; Population: FITTED; Authority: TI_TS3A27518E_SCDS260F; MPN: ERJ-2RKF1002X; Package: 0402; Value: 10 kOhm 1%; Footprint: Resistor_SMD:R_0402_1005Metric
R47 = R47_ERJ-2RKF1003X: Manufacturer: Panasonic; Population: FITTED; Authority: TI_TS3A27518E_SCDS260F; MPN: ERJ-2RKF1003X; Package: 0402; Value: 100 kOhm 1%; Footprint: Resistor_SMD:R_0402_1005Metric
R48 = R48_ERJ-2RKF1002X: Manufacturer: Panasonic; Population: FITTED; Authority: TE_C-2336582_A2; MPN: ERJ-2RKF1002X; Package: 0402; Value: 10 kOhm 1%; Footprint: Resistor_SMD:R_0402_1005Metric
R49 = R49_ERJ-2RKF1002X: Manufacturer: Panasonic; Population: FITTED; Authority: TE_C-2336582_A2; MPN: ERJ-2RKF1002X; Package: 0402; Value: 10 kOhm 1%; Footprint: Resistor_SMD:R_0402_1005Metric
R50 = R50_ERJ-2GE0R00X: Manufacturer: Panasonic; Population: FITTED; Authority: Quectel_BG95_HW_Design_v1.6; MPN: ERJ-2GE0R00X; Package: 0402; Value: 0 Ohm; Footprint: Resistor_SMD:R_0402_1005Metric
R51 = R51_ERJ-2GE0R00X: Manufacturer: Panasonic; Population: FITTED; Authority: Quectel_BG95_HW_Design_v1.6; MPN: ERJ-2GE0R00X; Package: 0402; Value: 0 Ohm; Footprint: Resistor_SMD:R_0402_1005Metric
R52 = R52_ERJ-2GE0R00X: Manufacturer: Panasonic; Population: FITTED; Authority: Quectel_BG95_HW_Design_v1.6; MPN: ERJ-2GE0R00X; Package: 0402; Value: 0 Ohm; Footprint: Resistor_SMD:R_0402_1005Metric
R53 = R53_ERJ-2GE0R00X: Manufacturer: Panasonic; Population: FITTED; Authority: Quectel_BG95_HW_Design_v1.6; MPN: ERJ-2GE0R00X; Package: 0402; Value: 0 Ohm; Footprint: Resistor_SMD:R_0402_1005Metric
R54 = R54_ERJ-2GE0R00X: Manufacturer: Panasonic; Population: FITTED; Authority: Quectel_BG95_HW_Design_v1.6; MPN: ERJ-2GE0R00X; Package: 0402; Value: 0 Ohm; Footprint: Resistor_SMD:R_0402_1005Metric
R55 = R55_ERJ-2GE0R00X: Manufacturer: Panasonic; Population: FITTED; Authority: Quectel_BG95_HW_Design_v1.6; MPN: ERJ-2GE0R00X; Package: 0402; Value: 0 Ohm; Footprint: Resistor_SMD:R_0402_1005Metric
TP_CELL_DBG = TP_CELL_DBG_TEST_PADS: Manufacturer: CONTROLLED_AUTHORITY; Population: FITTED; Authority: PCB_MAIN_CONNECTOR_FIXTURE_PIN_AUTHORITY_REV_A.csv; MPN: TEST_PADS; Package: POGO_FIXTURE_5P; Value: TEST_PADS
TP_CELL_USB = TP_CELL_USB_TEST_PADS: Manufacturer: CONTROLLED_AUTHORITY; Population: FITTED; Authority: PCB_MAIN_CONNECTOR_FIXTURE_PIN_AUTHORITY_REV_A.csv; MPN: TEST_PADS; Package: POGO_FIXTURE_4P; Value: TEST_PADS
U8 = U8_BG95-M3: Manufacturer: Quectel; Population: FITTED; Authority: PCB_MAIN_CELLULAR_PIN_AUTHORITY_REV_A.csv; MPN: BG95-M3; Package: LGA-102_23.6x19.9mm; Value: BG95-M3
U13 = U13_TS3A27518EPWR: Manufacturer: Texas Instruments; Population: FITTED; Authority: PCB_MAIN_DUAL_SIM_PIN_AUTHORITY_REV_A.csv; MPN: TS3A27518EPWR; Package: TSSOP-24_PW; Value: TS3A27518EPWR
U14 = U14_ESDALC6V1-5P6: Manufacturer: STMicroelectronics; Population: FITTED; Authority: PCB_MAIN_DUAL_SIM_PIN_AUTHORITY_REV_A.csv; MPN: ESDALC6V1-5P6; Package: SOT666_1.6x1.6mm; Value: ESDALC6V1-5P6
U15 = U15_ESDALC6V1-5P6: Manufacturer: STMicroelectronics; Population: FITTED; Authority: PCB_MAIN_DUAL_SIM_PIN_AUTHORITY_REV_A.csv; MPN: ESDALC6V1-5P6; Package: SOT666_1.6x1.6mm; Value: ESDALC6V1-5P6
U16 = U16_SN74AXC8T245PWR: Manufacturer: Texas Instruments; Population: FITTED; Authority: PCB_MAIN_CELLULAR_PIN_AUTHORITY_REV_A.csv; MPN: SN74AXC8T245PWR; Package: TSSOP-24_PW; Value: SN74AXC8T245PWR
U26 = U26_TPD2EUSB30DRTR: Manufacturer: Texas Instruments; Population: FITTED; Authority: TI_TPD2EUSB30_datasheet; MPN: TPD2EUSB30DRTR; Package: SOT-9X3_DRT; Value: 2 channel 0.7 pF USB ESD
U27 = U27_TPD4E05U06DQAR: Manufacturer: Texas Instruments; Population: FITTED; Authority: TI_TPDxE05U06_RevO; MPN: TPD4E05U06DQAR; Package: USON-10_DQA; Value: 4 channel 0.5 pF ESD

## Sheet PCB-MAIN_06_LORA.SchDoc
size 594 x 420 mm
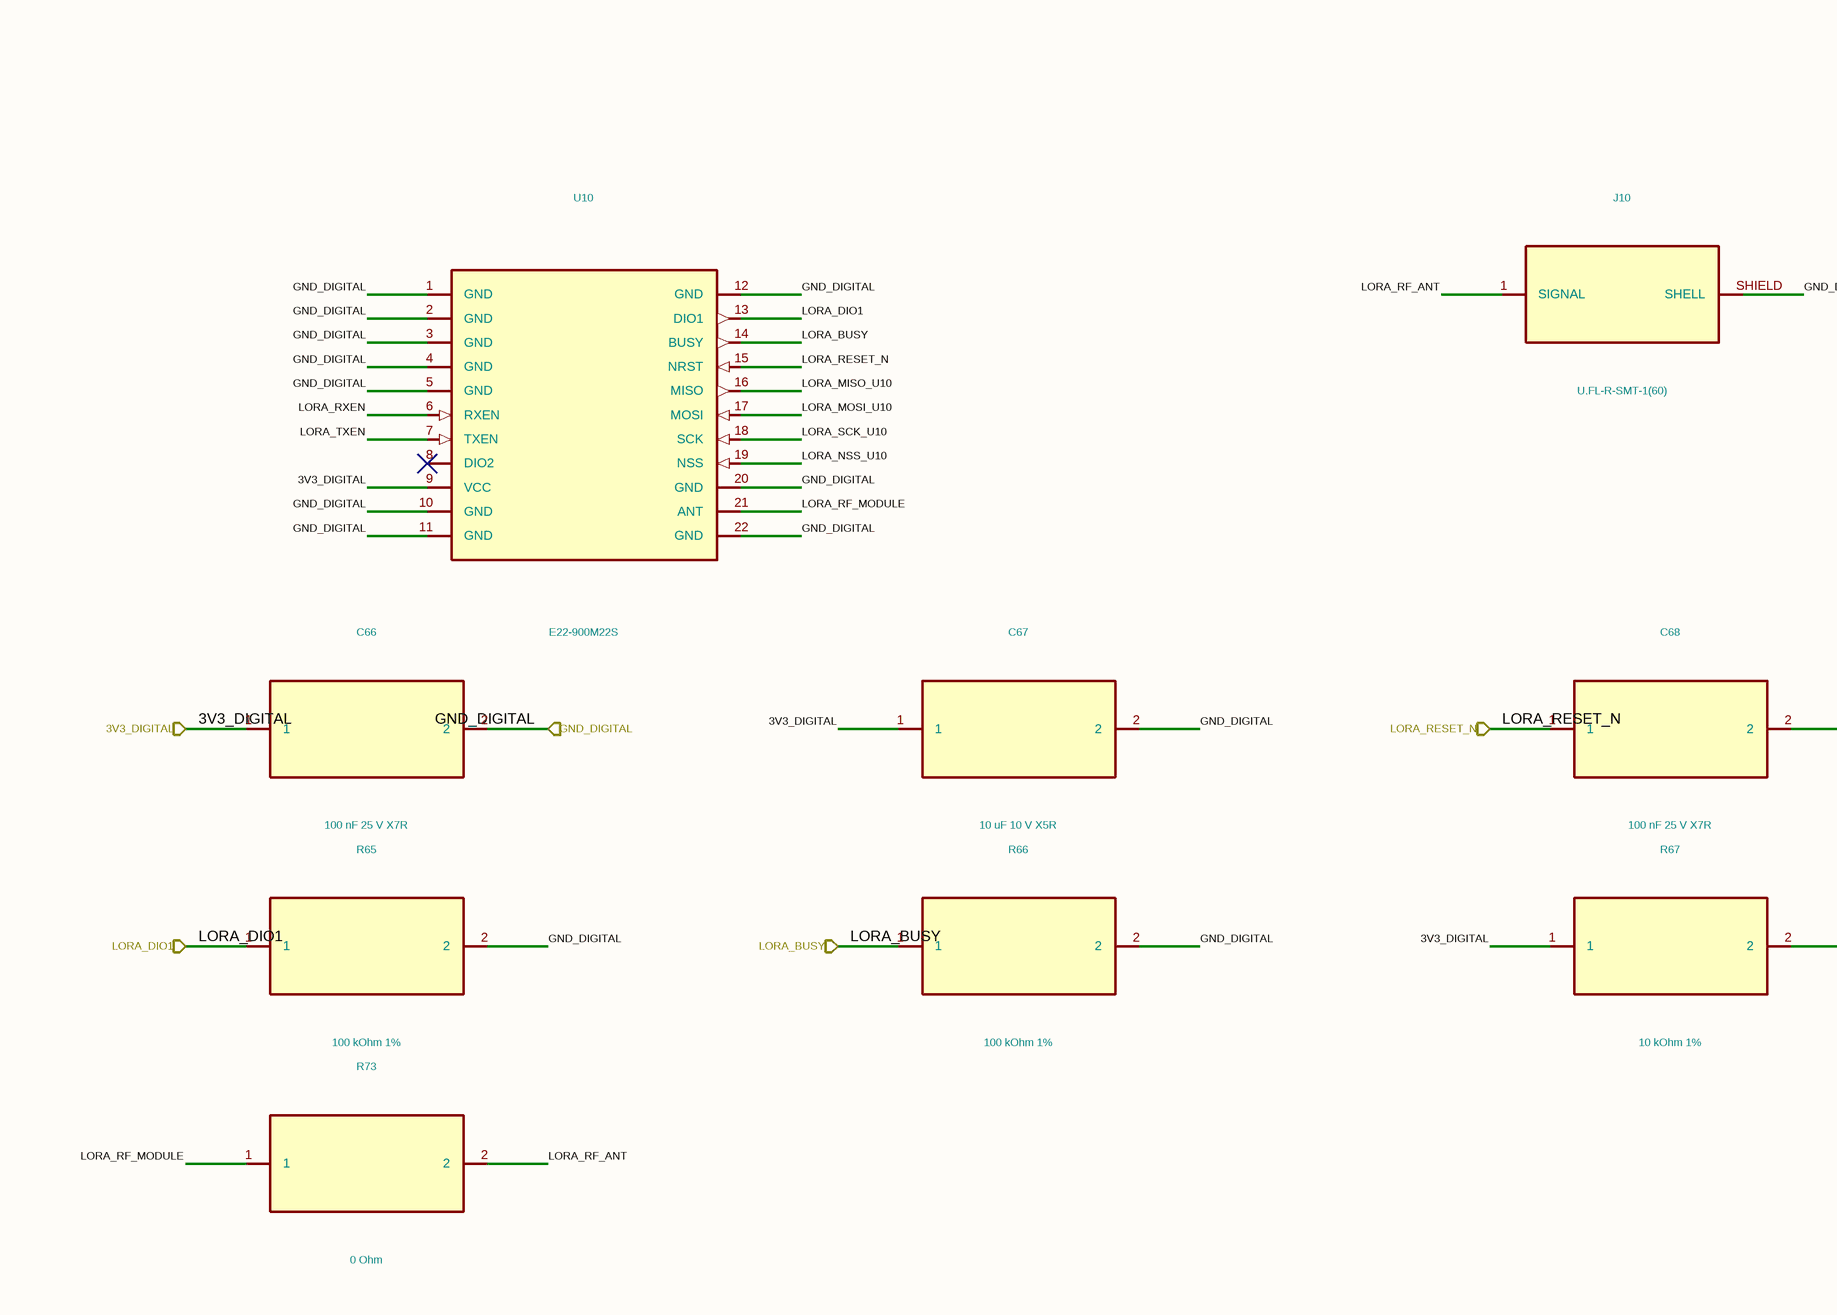
[diagram p38: PCB-MAIN_06_LORA.SchDoc, top left]
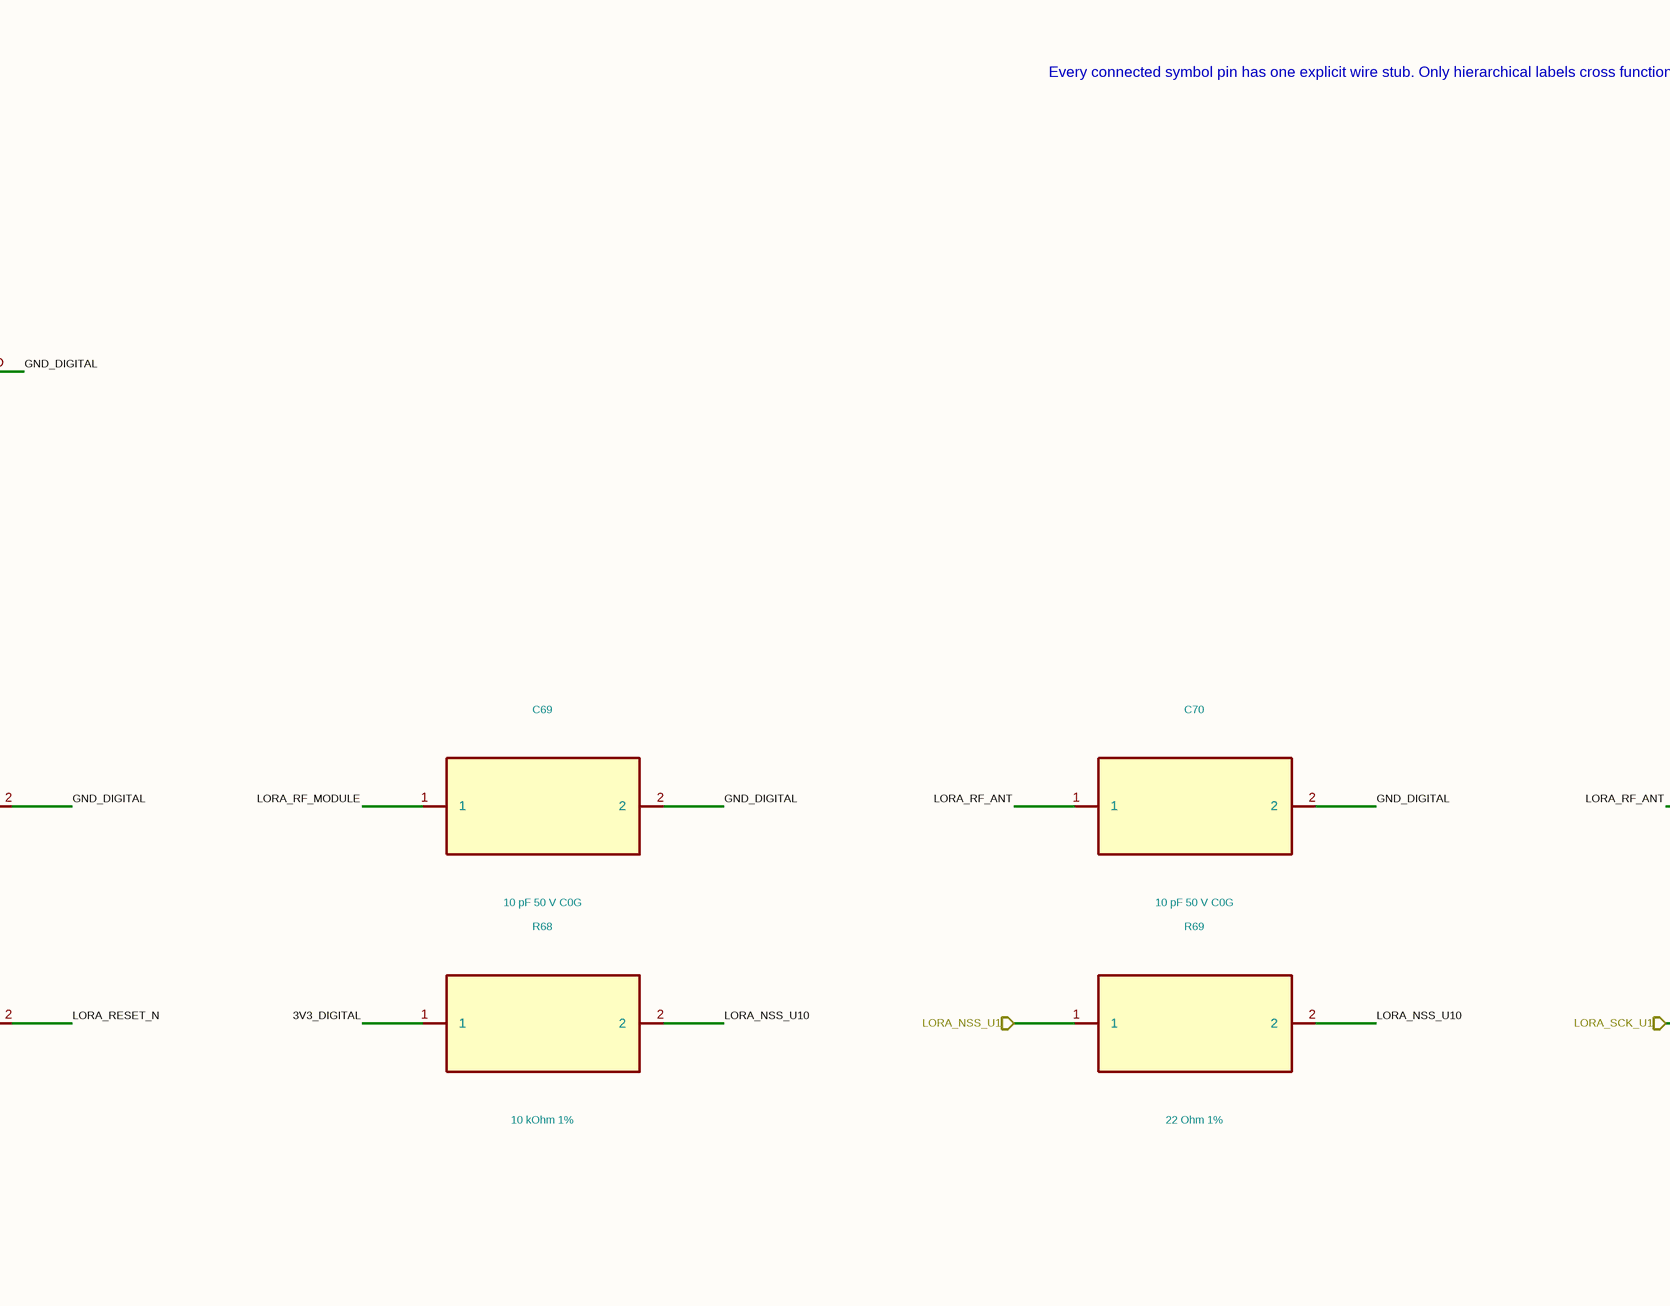
[diagram p39: PCB-MAIN_06_LORA.SchDoc, top middle]
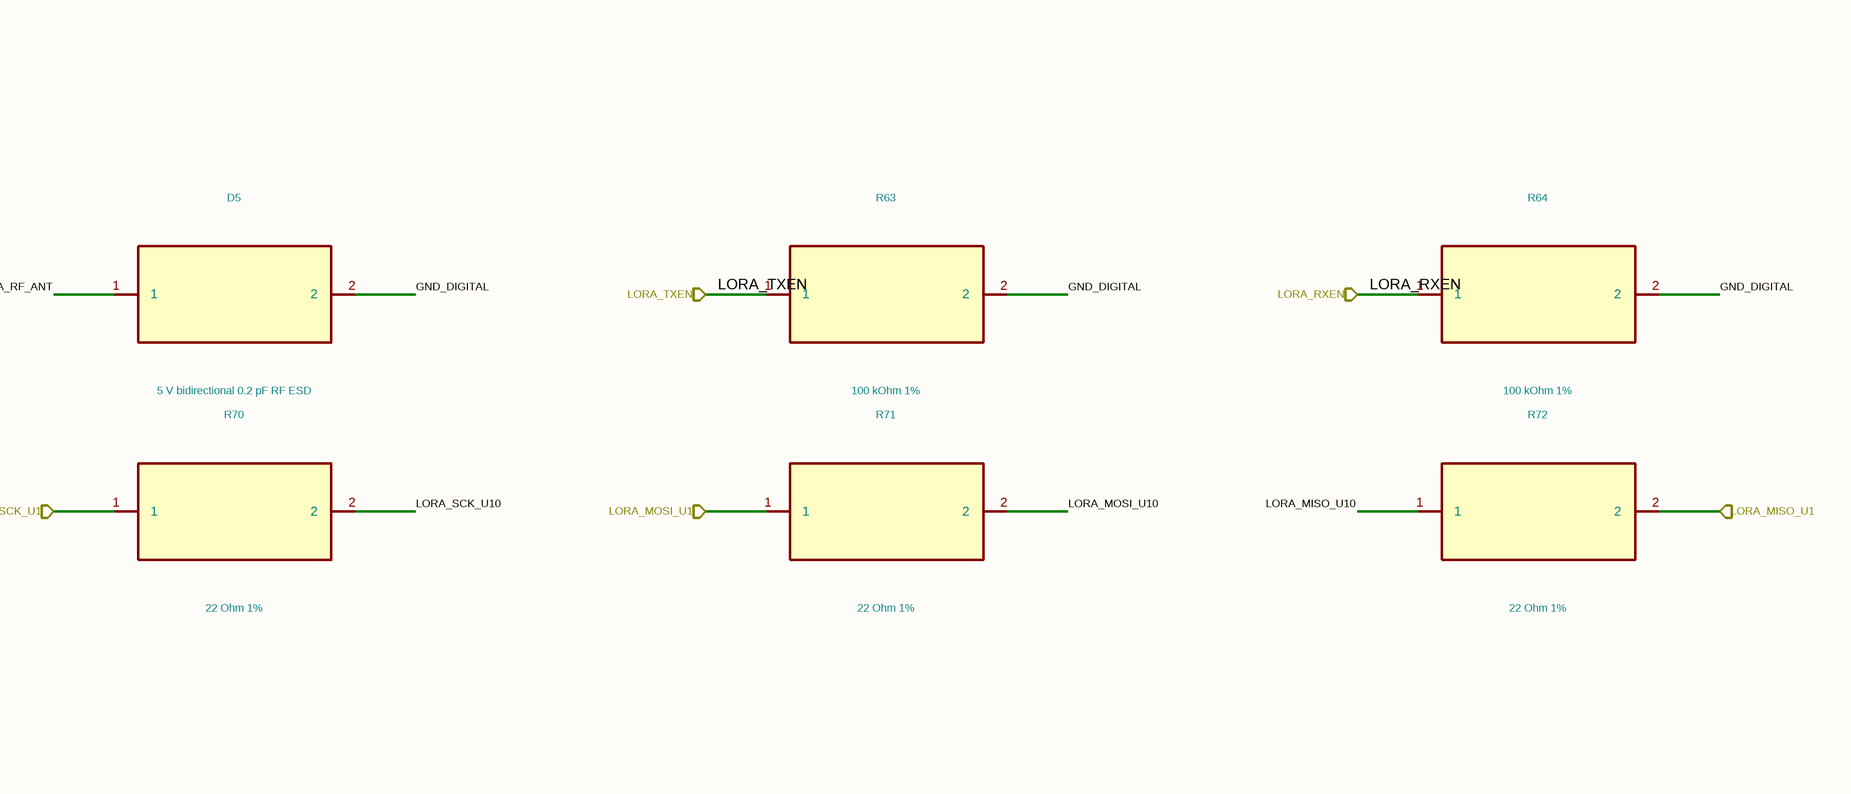
[diagram p40: PCB-MAIN_06_LORA.SchDoc, top right]
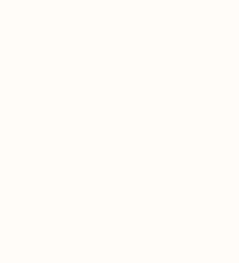
[diagram p41: PCB-MAIN_06_LORA.SchDoc, bottom left]

### Parts
C66  100 nF 25 V X7R  [C_0402_1005Metric]
C67  10 uF 10 V X5R  [C_0603_1608Metric]
C68  100 nF 25 V X7R  [C_0402_1005Metric]
C69  10 pF 50 V C0G  [C_0402_1005Metric]
C70  10 pF 50 V C0G  [C_0402_1005Metric]
D5  5 V bidirectional 0.2 pF RF ESD
J10  U.FL-R-SMT-1(60)
R63  100 kOhm 1%  [R_0402_1005Metric]
R64  100 kOhm 1%  [R_0402_1005Metric]
R65  100 kOhm 1%  [R_0402_1005Metric]
R66  100 kOhm 1%  [R_0402_1005Metric]
R67  10 kOhm 1%  [R_0402_1005Metric]
R68  10 kOhm 1%  [R_0402_1005Metric]
R69  22 Ohm 1%  [R_0402_1005Metric]
R70  22 Ohm 1%  [R_0402_1005Metric]
R71  22 Ohm 1%  [R_0402_1005Metric]
R72  22 Ohm 1%  [R_0402_1005Metric]
R73  0 Ohm  [R_0402_1005Metric]
U10  E22-900M22S

### Ports
3V3_DIGITAL, GND_DIGITAL, LORA_BUSY, LORA_DIO1, LORA_MISO_U1, LORA_MOSI_U1, LORA_NSS_U1, LORA_RESET_N, LORA_RXEN, LORA_SCK_U1, LORA_TXEN

### Nets
3V3_DIGITAL: C66.1 C67.1 R67.1 R68.1 U10.9(VCC) ; port 3V3_DIGITAL
GND_DIGITAL: C66.2 C67.2 C68.2 C69.2 C70.2 D5.2 J10.SHIELD(SHELL) R63.2 R64.2 R65.2 R66.2 U10.1(GND) U10.2(GND) U10.3(GND) U10.4(GND) U10.5(GND) U10.10(GND) U10.11(GND) U10.12(GND) U10.20(GND) U10.22(GND) ; port GND_DIGITAL
LORA_BUSY: R66.1 U10.14(BUSY) ; port LORA_BUSY
LORA_DIO1: R65.1 U10.13(DIO1) ; port LORA_DIO1
LORA_MISO_U1: R72.2 ; port LORA_MISO_U1
LORA_MISO_U10: R72.1 U10.16(MISO)
LORA_MOSI_U1: R71.1 ; port LORA_MOSI_U1
LORA_MOSI_U10: R71.2 U10.17(MOSI)
LORA_NSS_U1: R69.1 ; port LORA_NSS_U1
LORA_NSS_U10: R68.2 R69.2 U10.19(NSS)
LORA_RESET_N: C68.1 R67.2 U10.15(NRST) ; port LORA_RESET_N
LORA_RF_ANT: C70.1 D5.1 J10.1(SIGNAL) R73.2
LORA_RF_MODULE: C69.1 R73.1 U10.21(ANT)
LORA_RXEN: R64.1 U10.6(RXEN) ; port LORA_RXEN
LORA_SCK_U1: R70.1 ; port LORA_SCK_U1
LORA_SCK_U10: R70.2 U10.18(SCK)
LORA_TXEN: R63.1 U10.7(TXEN) ; port LORA_TXEN

Not connected (* = marked no-connect by the designer): U10 8(DIO2)*

### Notes on the sheet
- Every connected symbol pin has one explicit wire stub. Only hierarchical labels cross functional-sheet boundaries.
- 1
- 2
- 3
- 4
- 5
- 6
- 7
- 8
- 9
- 10
- 11
- A
- B
- C
- D
- E
- F
- G
- H
- Human-readable hierarchy candidate; exact Review-A pin/net equivalence enforced
- Functional sheet 7 of 10
- NOT FOR MANUFACTURE - hierarchy review/routing/DRC/DFM/Review B pending
- Title: Dioneya PCB-MAIN Rev.A - LoRa
- File: PCB-MAIN_06_LORA.kicad_sch
- Sheet: /
- Dioneya / ZS-BPLA
- KiCad E.D.A.  kicad (5.1.4)-1
- Size: A2
- Date: 2026-09-16
- Rev: A
- Id: 1/1

### Library data of the parts
C66 = C66_GRM155R71E104KE14D: Manufacturer: Murata; Population: FITTED; Authority: Ebyte_E22-M_v1.2; MPN: GRM155R71E104KE14D; Package: 0402; Value: 100 nF 25 V X7R; Footprint: Capacitor_SMD:C_0402_1005Metric
C67 = C67_GRM188R61A106KE69D: Manufacturer: Murata; Population: FITTED; Authority: Ebyte_E22-M_v1.2; MPN: GRM188R61A106KE69D; Package: 0603; Value: 10 uF 10 V X5R; Footprint: Capacitor_SMD:C_0603_1608Metric
C68 = C68_GRM155R71E104KE14D: Manufacturer: Murata; Population: FITTED; Authority: Ebyte_E22-M_v1.2; MPN: GRM155R71E104KE14D; Package: 0402; Value: 100 nF 25 V X7R; Footprint: Capacitor_SMD:C_0402_1005Metric
C69 = C69_GRM1555C1H100JA01D: Manufacturer: Murata; Population: DNP; Authority: Ebyte_E22-M_v1.2; MPN: GRM1555C1H100JA01D; Package: 0402; Value: 10 pF 50 V C0G; Footprint: Capacitor_SMD:C_0402_1005Metric
C70 = C70_GRM1555C1H100JA01D: Manufacturer: Murata; Population: DNP; Authority: Ebyte_E22-M_v1.2; MPN: GRM1555C1H100JA01D; Package: 0402; Value: 10 pF 50 V C0G; Footprint: Capacitor_SMD:C_0402_1005Metric
D5 = D5_PESD5V0C1BSF: Manufacturer: Nexperia; Population: FITTED; Authority: Nexperia_PESD5V0C1BSF_v3; MPN: PESD5V0C1BSF; Package: SOD962-2; Value: 5 V bidirectional 0.2 pF RF ESD
J10 = J10_U.FL-R-SMT-1_60: Manufacturer: CONTROLLED_AUTHORITY; Population: FITTED; Authority: PCB_MAIN_LORA_PIN_AUTHORITY_REV_A.csv;PCB_MAIN_CONNECTOR_FIXTURE_PIN_AUTHORITY_REV_A.csv; MPN: U.FL-R-SMT-1(60); Package: U.FL_SMT; Value: U.FL-R-SMT-1(60)
R63 = R63_ERJ-2RKF1003X: Manufacturer: Panasonic; Population: FITTED; Authority: Ebyte_E22-M_v1.2; MPN: ERJ-2RKF1003X; Package: 0402; Value: 100 kOhm 1%; Footprint: Resistor_SMD:R_0402_1005Metric
R64 = R64_ERJ-2RKF1003X: Manufacturer: Panasonic; Population: FITTED; Authority: Ebyte_E22-M_v1.2; MPN: ERJ-2RKF1003X; Package: 0402; Value: 100 kOhm 1%; Footprint: Resistor_SMD:R_0402_1005Metric
R65 = R65_ERJ-2RKF1003X: Manufacturer: Panasonic; Population: FITTED; Authority: Ebyte_E22-M_v1.2; MPN: ERJ-2RKF1003X; Package: 0402; Value: 100 kOhm 1%; Footprint: Resistor_SMD:R_0402_1005Metric
R66 = R66_ERJ-2RKF1003X: Manufacturer: Panasonic; Population: FITTED; Authority: Ebyte_E22-M_v1.2; MPN: ERJ-2RKF1003X; Package: 0402; Value: 100 kOhm 1%; Footprint: Resistor_SMD:R_0402_1005Metric
R67 = R67_ERJ-2RKF1002X: Manufacturer: Panasonic; Population: FITTED; Authority: Ebyte_E22-M_v1.2; MPN: ERJ-2RKF1002X; Package: 0402; Value: 10 kOhm 1%; Footprint: Resistor_SMD:R_0402_1005Metric
R68 = R68_ERJ-2RKF1002X: Manufacturer: Panasonic; Population: FITTED; Authority: Ebyte_E22-M_v1.2; MPN: ERJ-2RKF1002X; Package: 0402; Value: 10 kOhm 1%; Footprint: Resistor_SMD:R_0402_1005Metric
R69 = R69_ERJ-2RKF22R0X: Manufacturer: Panasonic; Population: FITTED; Authority: Ebyte_E22-M_v1.2; MPN: ERJ-2RKF22R0X; Package: 0402; Value: 22 Ohm 1%; Footprint: Resistor_SMD:R_0402_1005Metric
R70 = R70_ERJ-2RKF22R0X: Manufacturer: Panasonic; Population: FITTED; Authority: Ebyte_E22-M_v1.2; MPN: ERJ-2RKF22R0X; Package: 0402; Value: 22 Ohm 1%; Footprint: Resistor_SMD:R_0402_1005Metric
R71 = R71_ERJ-2RKF22R0X: Manufacturer: Panasonic; Population: FITTED; Authority: Ebyte_E22-M_v1.2; MPN: ERJ-2RKF22R0X; Package: 0402; Value: 22 Ohm 1%; Footprint: Resistor_SMD:R_0402_1005Metric
R72 = R72_ERJ-2RKF22R0X: Manufacturer: Panasonic; Population: FITTED; Authority: Ebyte_E22-M_v1.2; MPN: ERJ-2RKF22R0X; Package: 0402; Value: 22 Ohm 1%; Footprint: Resistor_SMD:R_0402_1005Metric
R73 = R73_ERJ-2GE0R00X: Manufacturer: Panasonic; Population: FITTED; Authority: Ebyte_E22-M_v1.2; MPN: ERJ-2GE0R00X; Package: 0402; Value: 0 Ohm; Footprint: Resistor_SMD:R_0402_1005Metric
U10 = U10_E22-900M22S: Manufacturer: Ebyte; Population: FITTED; Authority: PCB_MAIN_LORA_PIN_AUTHORITY_REV_A.csv; MPN: E22-900M22S; Package: SMD_20x14_22P_1.27mm; Value: E22-900M22S